# Altium project rp2350_led_control.PrjPcb (part 1 of 2)
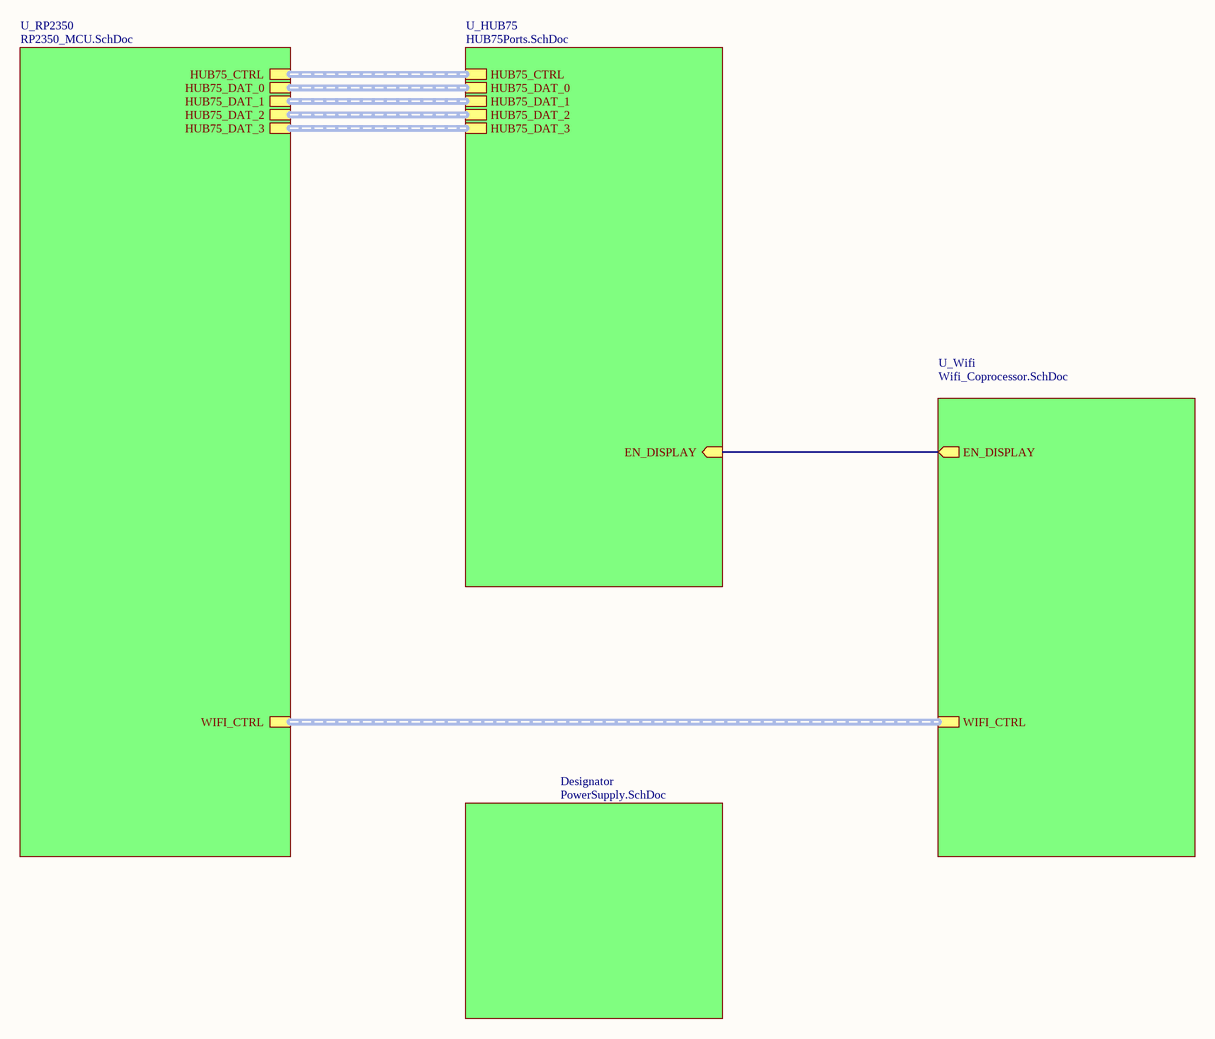
[diagram p0: Mainboard.SchDoc]
5 sheets, 168 parts. Net scope: hierarchical (ports join the sheet entries above them; power ports are global).
Board file: rp2350_led_control_pcb.PcbDoc
Sheets:
  Mainboard.SchDoc
    Designator = PowerSupply.SchDoc
    U_RP2350 = RP2350_MCU.SchDoc
    U_HUB75 = HUB75Ports.SchDoc
    U_Wifi = Wifi_Coprocessor.SchDoc

## Sheet Mainboard.SchDoc
size A3; SheetNumber: 1; SheetTotal: 5

### Sub-sheets
Designator = PowerSupply.SchDoc: no entries
U_HUB75 = HUB75Ports.SchDoc: HUB75_CTRL (harness HUB75_CTRL), HUB75_DAT_0 (harness HUB75_DAT_0), HUB75_DAT_1 (harness HUB75_DAT_1), HUB75_DAT_2 (harness HUB75_DAT_2), HUB75_DAT_3 (harness HUB75_DAT_3), EN_DISPLAY (in)
U_RP2350 = RP2350_MCU.SchDoc: HUB75_CTRL (harness HUB75_CTRL), WIFI_CTRL (harness WIFI_CTRL), HUB75_DAT_0 (harness HUB75_DAT_0), HUB75_DAT_2 (harness HUB75_DAT_2), HUB75_DAT_3 (harness HUB75_DAT_3), HUB75_DAT_1 (harness HUB75_DAT_1)
U_Wifi = Wifi_Coprocessor.SchDoc: WIFI_CTRL (harness WIFI_CTRL), EN_DISPLAY (out)

### Nets
EN_DISPLAY: sheet U_HUB75/EN_DISPLAY, sheet U_Wifi/EN_DISPLAY

### Buses and harness runs
harness sheet U_HUB75/HUB75_CTRL = sheet U_RP2350/HUB75_CTRL
harness sheet U_HUB75/HUB75_DAT_0 = sheet U_RP2350/HUB75_DAT_0
harness sheet U_HUB75/HUB75_DAT_1 = sheet U_RP2350/HUB75_DAT_1
harness sheet U_HUB75/HUB75_DAT_2 = sheet U_RP2350/HUB75_DAT_2
harness sheet U_HUB75/HUB75_DAT_3 = sheet U_RP2350/HUB75_DAT_3
harness sheet U_RP2350/WIFI_CTRL = sheet U_Wifi/WIFI_CTRL

## Sheet PowerSupply.SchDoc
size A3; SheetNumber: 2; SheetTotal: 5
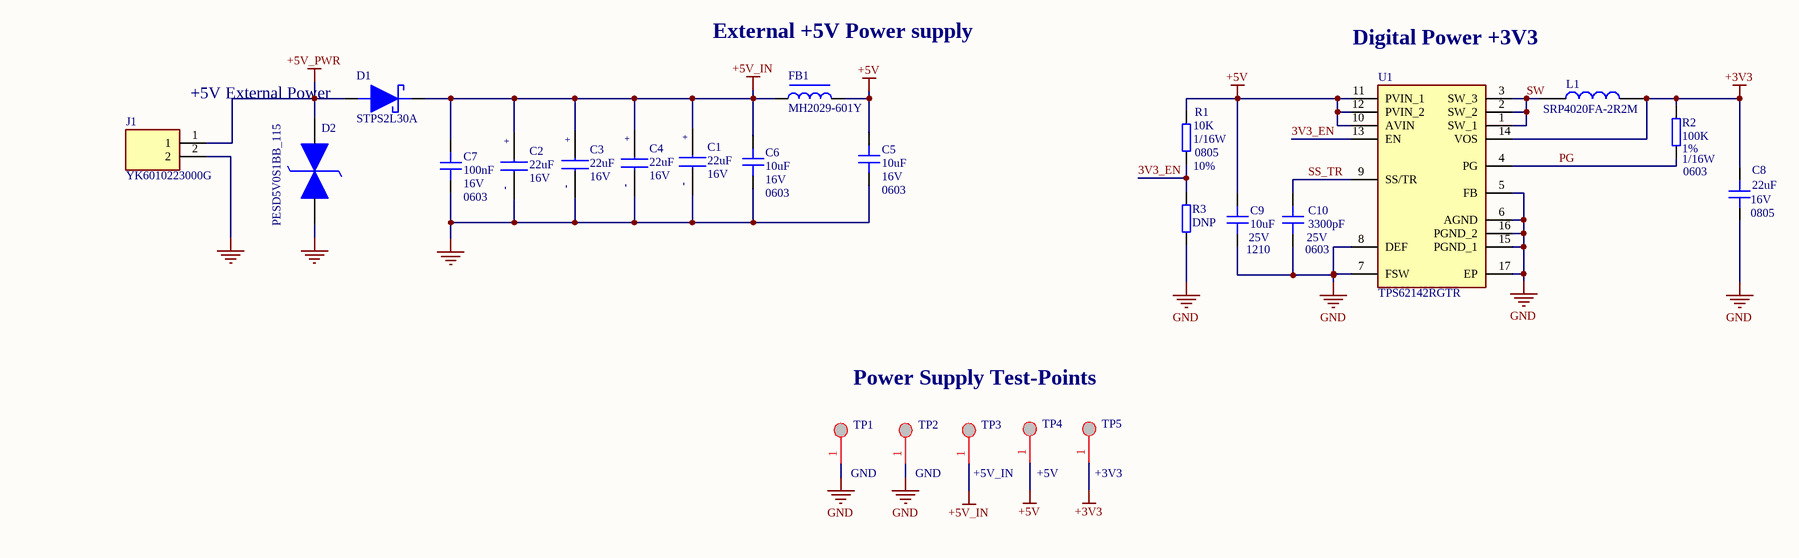
[diagram p1: PowerSupply.SchDoc]

### Parts
C1  value 22uF  Voltage: 16V  [CAPAE530X580N]  (hidden comment: 875105359003)
C2  value 22uF  Voltage: 16V  [CAPAE530X580N]  (hidden comment: 875105359003)
C3  value 22uF  Voltage: 16V  [CAPAE530X580N]  (hidden comment: 875105359003)
C4  value 22uF  Voltage: 16V  [CAPAE530X580N]  (hidden comment: 875105359003)
C5  10uF  Voltage: 16V  Package: 0603  [C0603]
C6  10uF  Voltage: 16V  Package: 0603  [C0603]
C7  100nF  Voltage: 16V  Package: 0603  [C0603]
C8  22uF  Voltage: 16V  Package: 0805  [C0805]
C9  10uF  Voltage: 25V  Package: 1210  [C1210]
C10  3300pF  Voltage: 25V  Package: 0603  [C0603]
D1  STPS2L30A  [SMA_STM]
D2  PESD5V0S1BB_115  [SODFL1608X65N]
FB1  MH2029-601Y  [BEADC2012X110N]
J1  YK6010223000G  [YK6010223000G]
L1  SRP4020FA-2R2M  [SRP4020FA2R2M]
R1  10K  Package: 0805  Tolerence: 10%  Power: 1/16W  [R0805_2012]
R2  100K  Package: 0603  Tolerence: 1%  Power: 1/16W  [R0603_1608]
R3  DNP  [R0805_2012]
TP1  GND  [Test point SDT8]
TP2  GND  [Test point SDT8]
TP3  +5V_IN  [Test point SDT8]
TP4  +5V  [Test point SDT8]
TP5  +3V3  [Test point SDT8]
U1  TPS62142RGTR  [QFN50P300X300X100-17N-D]

### Nets
+3V3: C8.2 L1.2 R2.2 TP5.1 U1.14(VOS)
+5V: C5.2 C9.2 FB1.2 R1.1 TP4.1 U1.10(AVIN) U1.11(PVIN_1) U1.12(PVIN_2)
+5V_IN: C1.1(+) C2.1(+) C3.1(+) C4.1(+) C6.2 C7.2 D1.1(K) FB1.1 TP3.1
+5V_PWR: D1.2(A) D2.2(K2) J1.1
GND: C1.2(-) C2.2(-) C3.2(-) C4.2(-) C5.1 C6.1 C7.1 C8.1 C9.1 C10.1 D2.1(K1) J1.2 R3.2 TP1.1 TP2.1 U1.5(FB) U1.6(AGND) U1.7(FSW) U1.8(DEF) U1.15(PGND_1) U1.16(PGND_2) U1.17(EP)
3V3_EN: R1.2 R3.1 U1.13(EN)
PG: R2.1 U1.4(PG)
SS_TR: C10.2 U1.9(SS/TR)
SW: L1.1 U1.1(SW_1) U1.2(SW_2) U1.3(SW_3)

### Notes on the sheet
- External +5V Power supply
- Digital Power +3V3
- (near J1) +5V External Power
- Power Supply Test-Points

### Library data of the parts
C1-C4 = 875105359003: WCAP-PSLP Aluminum Polymer Capacitors PSEC058220M016DVCTBB000; SMT V-Chip; 22 F +/- 20%; 16 V(DC); 2000 h; -55C / +105C; size DxL 5.0 x 5.8; ESR 30 m; Max. Iripple 2200 mA @100 kHz; LC 400 A; DF 8 %; Manufacturer_Name: Wurth Elektronik; Geometry.Height: 5.8mm; Manufacturer_Part_Number: 875105359003; Mouser Part Number: 710-875105359003; Mouser Price/Stock: https://www.mouser.co.uk/ProductDetail/Wurth-Elektronik/875105359003?qs=0KOYDY2FL29jQO14iscAeA%3D%3D; Arrow Part Number: *; Arrow Price/Stock: *; Datasheet Link: https://www.we-online.com/catalog/datasheet/875105359003.pdf
C5 C6 = CAP_0603_16V: SMD Capacitor; Tolerance: 10%; Temperature Coefficient: X7R; Designator: ?; Value: 10uF; Dielectric: ?; Manufacturer Reference: ?; Power: ?; Excepted: ?
C7 = CAP_0603_16V: SMD Capacitor; Designator: ?; Value: 100nF; Dielectric: ?; Manufacturer Reference: ?; Tolerance: ?; Power: ?; Excepted: ?
C8 = CAP_0805_16V: SMD Capacitor; Designator: ?; Value: 22uF; Dielectric: ?; Manufacturer Reference: ?; Tolerance: ?; Power: ?; Excepted: ?
C9 = CAP_1210_25V: SMD Capacitor; Designator: ?; Value: 10uF; Dielectric: ?; Manufacturer Reference: ?; Tolerance: ?; Power: ?; Excepted: ?
C10 = CAP_0603_25V: SMD Capacitor; Designator: ?; Value: 3300pF; Dielectric: ?; Manufacturer Reference: ?; Tolerance: ?; Power: ?; Excepted: ?
D1 = STPS2L30A: 30 V, 2 A Low Drop Power Schottky Rectifier; Manufacturer_Name: STMicroelectronics; Copyright: Copyright (C) 2025 Ultra Librarian. All rights reserved.; Manufacturer_Part_Number: STPS2L30A
D2 = PESD5V0S1BB_115: PESD5V0S1BB - Bidirectional ESD protection diode; Manufacturer_Name: Nexperia; Manufacturer_Part_Number: PESD5V0S1BB,115; Geometry.Height: 0.65mm; Mouser Part Number: 771-PESD5V0S1BB-T/R; Mouser Price/Stock: https://www.mouser.co.uk/ProductDetail/Nexperia/PESD5V0S1BB115?qs=LOCUfHb8d9vW06zz0pOppQ%3D%3D; Arrow Part Number: PESD5V0S1BB,115; Arrow Price/Stock: https://www.arrow.com/en/products/pesd5v0s1bb115/nexperia?region=nac; Datasheet Link: https://assets.nexperia.com/documents/data-sheet/PESD5V0S1BB.pdf
FB1 = MH2029-601Y: BOURNS - MH2029-601Y - FERRITE, BEAD, 0805, 0.2OHM, 1A; Geometry.Height: 1.1mm; Manufacturer_Name: Bourns; Manufacturer_Part_Number: MH2029-601Y; Mouser Part Number: 652-MH2029-601Y; Mouser Price/Stock: https://www.mouser.co.uk/ProductDetail/Bourns/MH2029-601Y?qs=aqFbwuCjQomuno9nfXC5VQ%3D%3D; Arrow Part Number: MH2029-601Y; Arrow Price/Stock: https://www.arrow.com/en/products/mh2029-601y/bourns?utm_currency=USD&region=europe; Datasheet Link: http://www.bourns.com/docs/Product-Datasheets/mh.pdf
J1 = YK6010223000G: 2 Circuit 0.394" (10.00mm) Barrier Block Connector Screws with Captive Plate 20A  300V PC Pin Through Hole -40C ~ 115C; Manufacturer_Name: Amphenol; Geometry.Height: 20mm; Manufacturer_Part_Number: YK6010223000G; Mouser Part Number: 649-YK60102230J0G; Mouser Price/Stock: https://www.mouser.co.uk/ProductDetail/Amphenol-Anytek/YK6010223000G?qs=Mv7BduZupUhsrUKvI0zJrA%3D%3D; Arrow Part Number: *; Arrow Price/Stock: *; Datasheet Link: https://www.anytek.com.tw/Upload/8YK0006601%E5%B7%B2%E8%9E%8D%E5%90%88-16535753519.pdf
L1 = SRP4020FA-2R2M: Fixed Inductors 2.2uH 20% 8A; Manufacturer_Name: Bourns; Geometry.Height: 2.1mm; Manufacturer_Part_Number: SRP4020FA-2R2M; Mouser Part Number: 652-SRP4020FA-2R2M; Mouser Price/Stock: https://www.mouser.co.uk/ProductDetail/Bourns/SRP4020FA-2R2M?qs=MLItCLRbWswKB3debRJXpA%3D%3D; Arrow Part Number: SRP4020FA-2R2M; Arrow Price/Stock: https://www.arrow.com/en/products/srp4020fa-2r2m/bourns.html?utm_currency=USD&region=nac; Datasheet Link: https://www.bourns.com/docs/Product-Datasheets/SRP4020FA.pdf
R1 R2 = Resistor: SMD Resistor; Voltage: ?; Dielectric: ?; Manufacturer Reference: ?; Excepted: ?
  R1: Designator: ?; Value: 10K
  R2: Value: 100K
R3 = Resistor: SMD Resistor; Tolerence: 1%; Power: 1/16W; Designator: ?; Value: DNP; Voltage: ?; Dielectric: ?; Manufacturer Reference: ?; Package: 0805; Excepted: ?
TP1-TP5 = TEST_P SDT8: Designator: ?; Dielectric: ?; Excepted: ?; Package: ?; Power: ?; Tolerance: ?; Value: ?; Voltage: ?
U1 = TPS62142RGTR: TEXAS INSTRUMENTS - TPS62142RGTR - DC/DC CONV, SYNC BUCK, 2.5MHZ, VQFN-16, Switch step down converter; Geometry.Height: 1mm; Manufacturer_Name: Texas Instruments; Manufacturer_Part_Number: TPS62142RGTR; Mouser Part Number: 595-TPS62142RGTR; Mouser Price/Stock: https://www.mouser.co.uk/ProductDetail/Texas-Instruments/TPS62142RGTR?qs=gXEV9p%2FxLgdJ2ViLpYqiRw%3D%3D; Arrow Part Number: TPS62142RGTR; Arrow Price/Stock: https://www.arrow.com/en/products/tps62142rgtr/texas-instruments?region=nac; Datasheet Link: http://www.ti.com/lit/ds/symlink/tps62140.pdf

## Sheet RP2350_MCU.SchDoc
size A3; SheetNumber: 3; SheetTotal: 5
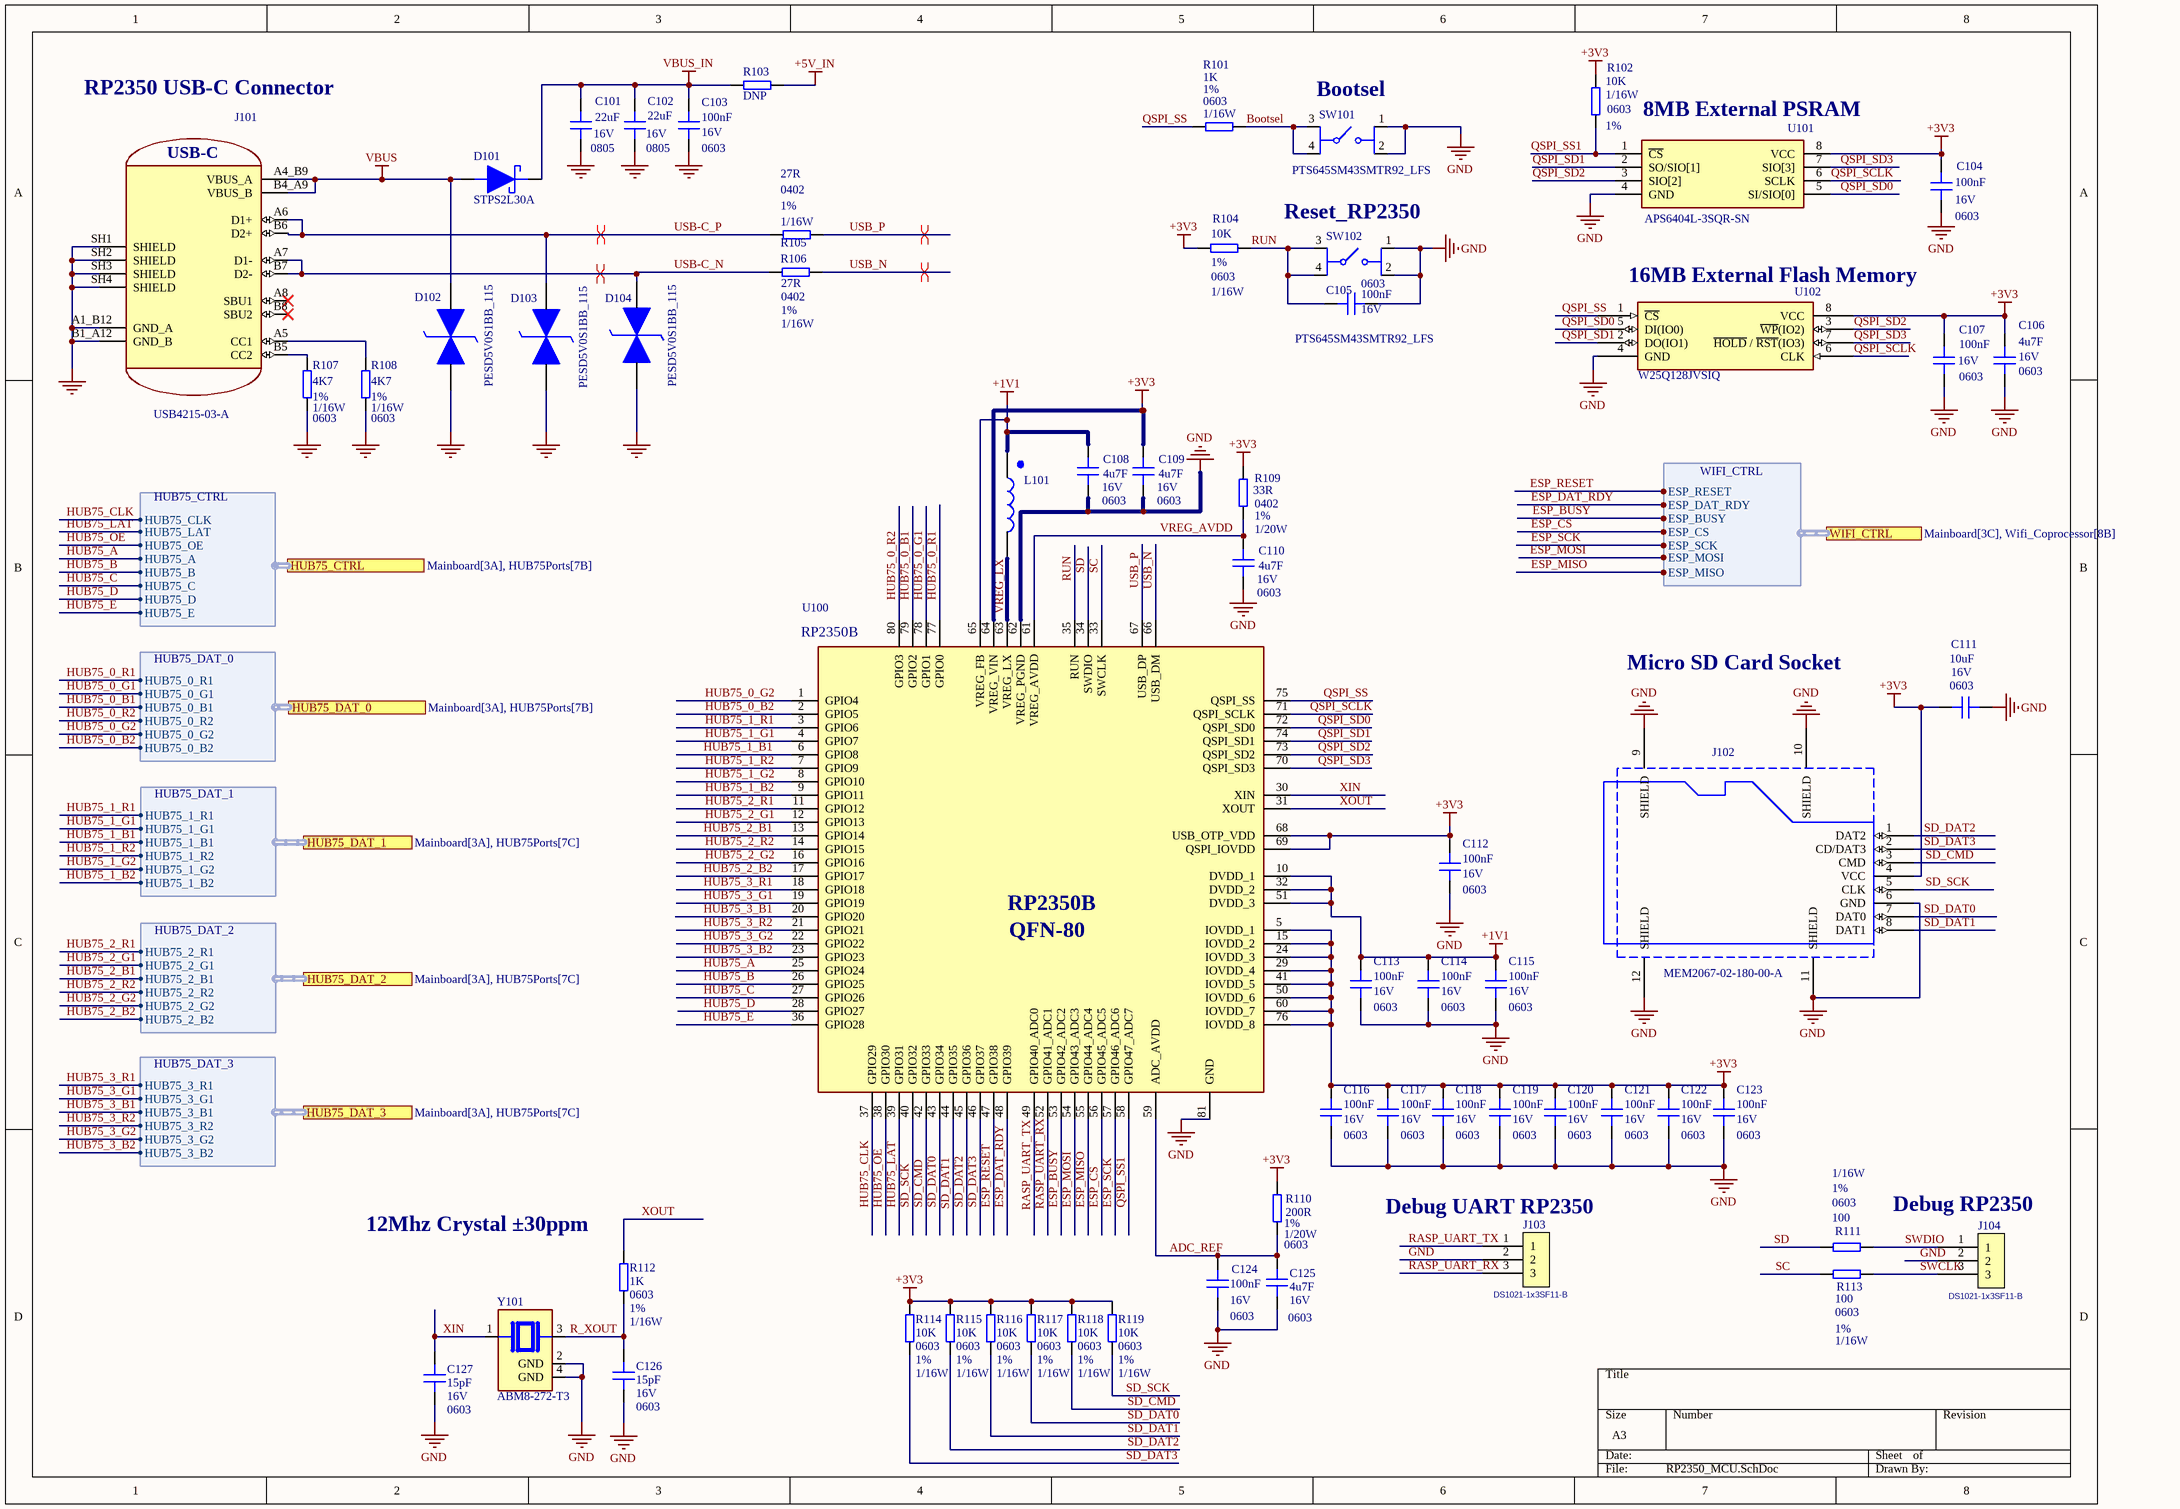
[diagram p2: RP2350_MCU.SchDoc]

### Parts
C101  22uF  Voltage: 16V  Package: 0805  [C0805]
C102  22uF  Voltage: 16V  Package: 0805  [C0805]
C103  100nF  Voltage: 16V  Package: 0603  [C0603]
C104  100nF  Voltage: 16V  Package: 0603  [C0603]
C105  100nF  Voltage: 16V  Package: 0603  [C0603]
C106  4u7F  Voltage: 16V  Package: 0603  [C0603]
C107  100nF  Voltage: 16V  Package: 0603  [C0603]
C108  4u7F  Voltage: 16V  Package: 0603  [C0603]
C109  4u7F  Voltage: 16V  Package: 0603  [C0603]
C110  4u7F  Voltage: 16V  Package: 0603  [C0603]
C111  10uF  Voltage: 16V  Package: 0603  [C0603]
C112  100nF  Voltage: 16V  Package: 0603  [C0402]
C113  100nF  Voltage: 16V  Package: 0603  [C0603]
C114  100nF  Voltage: 16V  Package: 0603  [C0603]
C115  100nF  Voltage: 16V  Package: 0603  [C0603]
C116  100nF  Voltage: 16V  Package: 0603  [C0603]
C117  100nF  Voltage: 16V  Package: 0603  [C0603]
C118  100nF  Voltage: 16V  Package: 0603  [C0603]
C119  100nF  Voltage: 16V  Package: 0603  [C0603]
C120  100nF  Voltage: 16V  Package: 0603  [C0603]
C121  100nF  Voltage: 16V  Package: 0603  [C0603]
C122  100nF  Voltage: 16V  Package: 0603  [C0603]
C123  100nF  Voltage: 16V  Package: 0603  [C0603]
C124  100nF  Voltage: 16V  Package: 0603  [C0603]
C125  4u7F  Voltage: 16V  Package: 0603  [C0603]
C126  15pF  Voltage: 16V  Package: 0603  [C0603]
C127  15pF  Voltage: 16V  Package: 0603  [C0603]
D101  STPS2L30A  [SMA_STM]
D102  PESD5V0S1BB_115  [SODFL1608X65N]
D103  PESD5V0S1BB_115  [SODFL1608X65N]
D104  PESD5V0S1BB_115  [SODFL1608X65N]
J101  USB4215-03-A  [GCT_USB4215-03-A_REVA]
J102  MEM2067-02-180-00-A  [GCT_MEM2067-02-180-00-A_REVB]
J103  DS1021-1x3SF11-B  [HDR-TH_3P-P2.54-V-M]
J104  DS1021-1x3SF11-B  [HDR-TH_3P-P2.54-V-M]
L101  AOTA-B201610S3R3-101-T  [AOTAB201610S3R3101T]  (value not drawn)
R101  1K  Package: 0603  Tolerence: 1%  Power: 1/16W  [R0603_1608]
R102  10K  Package: 0603  Tolerence: 1%  Power: 1/16W  [R0603_1608]
R103  DNP  [R0805_2012]
R104  10K  Package: 0603  Tolerence: 1%  Power: 1/16W  [R0603_1608]
R105  27R  Package: 0402  Tolerence: 1%  Power: 1/16W  [R0402_1005]
R106  27R  Package: 0402  Tolerence: 1%  Power: 1/16W  [R0402_1005]
R107  4K7  Package: 0603  Tolerence: 1%  Power: 1/16W  [R0603_1608]
R108  4K7  Package: 0603  Tolerence: 1%  Power: 1/16W  [R0603_1608]
R109  33R  Package: 0402  Tolerence: 1%  Power: 1/20W  [R0402_1005]
R110  200R  Package: 0603  Tolerence: 1%  Power: 1/20W  [R0603_1608]
R111  100  Package: 0603  Tolerence: 1%  Power: 1/16W  [R0603_1608]
R112  1K  Package: 0603  Tolerence: 1%  Power: 1/16W  [R0603_1608]
R113  100  Package: 0603  Tolerence: 1%  Power: 1/16W  [R0603_1608]
R114  10K  Package: 0603  Tolerence: 1%  Power: 1/16W  [R0603_1608]
R115  10K  Package: 0603  Tolerence: 1%  Power: 1/16W  [R0603_1608]
R116  10K  Package: 0603  Tolerence: 1%  Power: 1/16W  [R0603_1608]
R117  10K  Package: 0603  Tolerence: 1%  Power: 1/16W  [R0603_1608]
R118  10K  Package: 0603  Tolerence: 1%  Power: 1/16W  [R0603_1608]
R119  10K  Package: 0603  Tolerence: 1%  Power: 1/16W  [R0603_1608]
SW101  PTS645SM43SMTR92_LFS  [PTS645SM43SMTR92LFS]
SW102  PTS645SM43SMTR92_LFS  [PTS645SM43SMTR92LFS]
U100  RP2350B  [QFN40P1000X1000X90-81N-D]
U101  APS6404L-3SQR-SN  [SOIC127P600X175-8N]
U102  W25Q128JVSIQ  [SOIC127P790X216-8N]
Y101  ABM8-272-T3  [XTAL_ABM8-272-T3]

### Ports
HUB75_CTRL (harness HUB75_CTRL, see Mainboard[3A], HUB75Ports[7B]), HUB75_DAT_0 (harness HUB75_DAT_0, see Mainboard[3A], HUB75Ports[7B]), HUB75_DAT_1 (harness HUB75_DAT_1, see Mainboard[3A], HUB75Ports[7C]), HUB75_DAT_2 (harness HUB75_DAT_2, see Mainboard[3A], HUB75Ports[7C]), HUB75_DAT_3 (harness HUB75_DAT_3, see Mainboard[3A], HUB75Ports[7C]), WIFI_CTRL (harness WIFI_CTRL, see Mainboard[3C], Wifi_Coprocessor[8B])

### Harnesses
WIFI_CTRL: ESP_RESET, ESP_DAT_RDY, ESP_BUSY, ESP_CS, ESP_SCK, ESP_MOSI, ESP_MISO
HUB75_CTRL: HUB75_CLK, HUB75_LAT, HUB75_OE, HUB75_A, HUB75_B, HUB75_C, HUB75_D, HUB75_E
HUB75_DAT_0: HUB75_0_R1, HUB75_0_G1, HUB75_0_B1, HUB75_0_R2, HUB75_0_G2, HUB75_0_B2
HUB75_DAT_1: HUB75_1_R1, HUB75_1_G1, HUB75_1_B1, HUB75_1_R2, HUB75_1_G2, HUB75_1_B2
HUB75_DAT_2: HUB75_2_R1, HUB75_2_G1, HUB75_2_B1, HUB75_2_R2, HUB75_2_G2, HUB75_2_B2
HUB75_DAT_3: HUB75_3_R1, HUB75_3_G1, HUB75_3_B1, HUB75_3_R2, HUB75_3_G2, HUB75_3_B2

### Nets
+1V1: C108.2 C113.2 C114.2 C115.2 L101.1 U100.10(DVDD_1) U100.32(DVDD_2) U100.51(DVDD_3) U100.65(VREG_FB)
+3V3: C104.2 C106.2 C107.2 C109.2 C111.2 C112.2 C116.2 C117.2 C118.2 C119.2 C120.2 C121.2 C122.2 C123.2 J102.4(VCC) R102.2 R104.1 R109.2 R110.2 R114.1 R115.1 R116.1 R117.1 R118.1 R119.1 U100.5(IOVDD_1) U100.15(IOVDD_2) U100.24(IOVDD_3) U100.29(IOVDD_4) U100.41(IOVDD_5) U100.50(IOVDD_6) U100.60(IOVDD_7) U100.64(VREG_VIN) U100.68(USB_OTP_VDD) U100.69(QSPI_IOVDD) U100.76(IOVDD_8) U101.8(VCC) U102.8(VCC)
+5V_IN: R103.2
GND: C101.1 C102.1 C103.1 C104.1 C105.1 C106.1 C107.1 C108.1 C109.1 C110.1 C111.1 C112.1 C113.1 C114.1 C115.1 C116.1 C117.1 C118.1 C119.1 C120.1 C121.1 C122.1 C123.1 C124.1 C125.1 C126.1 C127.1 D102.1(K1) D103.1(K1) D104.1(K1) J101.A1_B12(GND_A) J101.B1_A12(GND_B) J101.SH1(SHIELD) J101.SH2(SHIELD) J101.SH3(SHIELD) J101.SH4(SHIELD) J102.6(GND) J102.9(SHIELD) J102.10(SHIELD) J102.11(SHIELD) J102.12(SHIELD) J103.2 J104.2 R107.1 R108.1 SW101.1(NO_1) SW101.2(NO_2) SW102.1(NO_1) SW102.2(NO_2) U100.62(VREG_PGND) U100.81(GND) U101.4(GND) U102.4(GND) Y101.2(GND) Y101.4(GND)
VBUS: D101.2(A) D102.2(K2) J101.A4_B9(VBUS_A) J101.B4_A9(VBUS_B)
VBUS_IN: C101.2 C102.2 C103.2 D101.1(K) R103.1
ADC_REF: C124.2 C125.2 R110.1 U100.59(ADC_AVDD)
Bootsel: R101.2 SW101.3(COM_1) SW101.4(COM_2)
ESP_BUSY: U100.53(GPIO42_ADC2) ; port WIFI_CTRL.ESP_BUSY
ESP_CS: U100.56(GPIO45_ADC5) ; port WIFI_CTRL.ESP_CS
ESP_DAT_RDY: U100.48(GPIO39) ; port WIFI_CTRL.ESP_DAT_RDY
ESP_MISO: U100.55(GPIO44_ADC4) ; port WIFI_CTRL.ESP_MISO
ESP_MOSI: U100.54(GPIO43_ADC3) ; port WIFI_CTRL.ESP_MOSI
ESP_RESET: U100.47(GPIO38) ; port WIFI_CTRL.ESP_RESET
ESP_SCK: U100.57(GPIO46_ADC6) ; port WIFI_CTRL.ESP_SCK
HUB75_0_B1: U100.79(GPIO2) ; port HUB75_DAT_0.HUB75_0_B1
HUB75_0_B2: U100.2(GPIO5) ; port HUB75_DAT_0.HUB75_0_B2
HUB75_0_G1: U100.78(GPIO1) ; port HUB75_DAT_0.HUB75_0_G1
HUB75_0_G2: U100.1(GPIO4) ; port HUB75_DAT_0.HUB75_0_G2
HUB75_0_R1: U100.77(GPIO0) ; port HUB75_DAT_0.HUB75_0_R1
HUB75_0_R2: U100.80(GPIO3) ; port HUB75_DAT_0.HUB75_0_R2
HUB75_1_B1: U100.6(GPIO8) ; port HUB75_DAT_1.HUB75_1_B1
HUB75_1_B2: U100.9(GPIO11) ; port HUB75_DAT_1.HUB75_1_B2
HUB75_1_G1: U100.4(GPIO7) ; port HUB75_DAT_1.HUB75_1_G1
HUB75_1_G2: U100.8(GPIO10) ; port HUB75_DAT_1.HUB75_1_G2
HUB75_1_R1: U100.3(GPIO6) ; port HUB75_DAT_1.HUB75_1_R1
HUB75_1_R2: U100.7(GPIO9) ; port HUB75_DAT_1.HUB75_1_R2
HUB75_2_B1: U100.13(GPIO14) ; port HUB75_DAT_2.HUB75_2_B1
HUB75_2_B2: U100.17(GPIO17) ; port HUB75_DAT_2.HUB75_2_B2
HUB75_2_G1: U100.12(GPIO13) ; port HUB75_DAT_2.HUB75_2_G1
HUB75_2_G2: U100.16(GPIO16) ; port HUB75_DAT_2.HUB75_2_G2
HUB75_2_R1: U100.11(GPIO12) ; port HUB75_DAT_2.HUB75_2_R1
HUB75_2_R2: U100.14(GPIO15) ; port HUB75_DAT_2.HUB75_2_R2
HUB75_3_B1: U100.20(GPIO20) ; port HUB75_DAT_3.HUB75_3_B1
HUB75_3_B2: U100.23(GPIO23) ; port HUB75_DAT_3.HUB75_3_B2
HUB75_3_G1: U100.19(GPIO19) ; port HUB75_DAT_3.HUB75_3_G1
HUB75_3_G2: U100.22(GPIO22) ; port HUB75_DAT_3.HUB75_3_G2
HUB75_3_R1: U100.18(GPIO18) ; port HUB75_DAT_3.HUB75_3_R1
HUB75_3_R2: U100.21(GPIO21) ; port HUB75_DAT_3.HUB75_3_R2
HUB75_A: U100.25(GPIO24) ; port HUB75_CTRL.HUB75_A
HUB75_B: U100.26(GPIO25) ; port HUB75_CTRL.HUB75_B
HUB75_C: U100.27(GPIO26) ; port HUB75_CTRL.HUB75_C
HUB75_CLK: U100.37(GPIO29) ; port HUB75_CTRL.HUB75_CLK
HUB75_D: U100.28(GPIO27) ; port HUB75_CTRL.HUB75_D
HUB75_E: U100.36(GPIO28) ; port HUB75_CTRL.HUB75_E
HUB75_LAT: U100.39(GPIO31) ; port HUB75_CTRL.HUB75_LAT
HUB75_OE: U100.38(GPIO30) ; port HUB75_CTRL.HUB75_OE
QSPI_SCLK: U100.71(QSPI_SCLK) U101.6(SCLK) U102.6(CLK)
QSPI_SD0: U100.72(QSPI_SD0) U101.5(SI/SIO[0]) U102.5(DI(IO0))
QSPI_SD1: U100.74(QSPI_SD1) U101.2(SO/SIO[1]) U102.2(DO(IO1))
QSPI_SD2: U100.73(QSPI_SD2) U101.3(SIO[2]) U102.3(~{WP}(IO2))
QSPI_SD3: U100.70(QSPI_SD3) U101.7(SIO[3]) U102.7(~{HOLD}_/_~{RST}(IO3))
QSPI_SS: R101.1 U100.75(QSPI_SS) U102.1(~{CS})
QSPI_SS1: R102.1 U100.58(GPIO47_ADC7) U101.1(~{CS})
R_XOUT: C126.2 R112.2 Y101.3
RASP_UART_RX: J103.3 U100.52(GPIO41_ADC1)
RASP_UART_TX: J103.1 U100.49(GPIO40_ADC0)
RUN: C105.2 R104.2 SW102.3(COM_1) SW102.4(COM_2) U100.35(RUN)
SC: R113.1 U100.33(SWCLK)
SD: R111.1 U100.34(SWDIO)
SD_CMD: J102.3(CMD) R118.2 U100.42(GPIO33)
SD_DAT0: J102.7(DAT0) R117.2 U100.43(GPIO34)
SD_DAT1: J102.8(DAT1) R116.2 U100.44(GPIO35)
SD_DAT2: J102.1(DAT2) R115.2 U100.45(GPIO36)
SD_DAT3: J102.2(CD/DAT3) R114.2 U100.46(GPIO37)
SD_SCK: J102.5(CLK) R119.2 U100.40(GPIO32)
SWCLK: J104.3 R113.2
SWDIO: J104.1 R111.2
USB-C_N: D104.2(K2) J101.A7(D1-) J101.B7(D2-) R106.1
USB-C_P: D103.2(K2) J101.A6(D1+) J101.B6(D2+) R105.1
USB_N: R106.2 U100.66(USB_DM)
USB_P: R105.2 U100.67(USB_DP)
VREG_AVDD: C110.2 R109.1 U100.61(VREG_AVDD)
VREG_LX: L101.2 U100.63(VREG_LX)
XIN: C127.2 U100.30(XIN) Y101.1
XOUT: R112.1 U100.31(XOUT)
NetJ101_A5: J101.A5(CC1) R108.2
NetJ101_B5: J101.B5(CC2) R107.2

Not connected (* = marked no-connect by the designer): J101 A8(SBU1)* B8(SBU2)*

### Layout directives
differential pair; differential pair class DIFF_USB: USB-C_N, USB-C_P, USB_N, USB_P

### Notes on the sheet
- RP2350 USB-C Connector
- (near SW101) Bootsel
- 8MB External PSRAM
- (near SW102) Reset_RP2350
- (near U102) 16MB External Flash Memory
- Micro SD Card Socket
- (near R112) 12Mhz Crystal ±30ppm
- (near J103) Debug UART RP2350
- Debug RP2350
- (in symbol RP2350B) QFN-80
- (in symbol USB4215-03-A) USB-C

### Library data of the parts
C101 C102 = CAP_0805_16V: SMD Capacitor; Designator: ?; Value: 22uF; Dielectric: ?; Manufacturer Reference: ?; Tolerance: ?; Power: ?; Excepted: ?
C103-C105 C107 C113-C124 C126 C127 = CAP_0603_16V: SMD Capacitor; Dielectric: ?; Manufacturer Reference: ?; Tolerance: ?; Power: ?; Excepted: ?
  C103-C105 C107: Designator: ?; Value: 100nF
  C113-C124: Value: 100nF
  C126 C127: Value: 15pF
C106 C108-C111 C125 = CAP_0603_16V: as C5 on sheet PowerSupply; Designator: ?; Dielectric: ?; Manufacturer Reference: ?; Power: ?; Excepted: ?
  C106 C108-C110 C125: Value: 4u7F
  C111: Value: 10uF
C112 = CAP_0402_16V: SMD Capacitor; Value: 100nF; Dielectric: ?; Manufacturer Reference: ?; Tolerance: ?; Power: ?; Excepted: ?
D101 = STPS2L30A: as D1 on sheet PowerSupply; Copyright: Copyright (C) 2025 Ultra Librarian. All rights reserved.; Manufacturer_Part_Number: STPS2L30A
D102-D104 = PESD5V0S1BB_115: as D2 on sheet PowerSupply; Mouser Part Number: 771-PESD5V0S1BB-T/R; Mouser Price/Stock: https://www.mouser.co.uk/ProductDetail/Nexperia/PESD5V0S1BB115?qs=LOCUfHb8d9vW06zz0pOppQ%3D%3D; Arrow Part Number: PESD5V0S1BB,115; Arrow Price/Stock: https://www.arrow.com/en/products/pesd5v0s1bb115/nexperia?region=nac; Datasheet Link: https://assets.nexperia.com/documents/data-sheet/PESD5V0S1BB.pdf
J101 = USB4215-03-A: USB-C (USB TYPE-C) USB 2.0 Receptacle Connector 24 (16+8 Dummy) Position Surface Mount, Right Angle; Through Hole; MF: Global Connector Technology; SnapEDA_Link: https://www.snapeda.com/parts/USB4215-03-A/Global+Connector+Technology/view-part/?ref=snap; Package: None; Value: *; MP: USB4215-03-A; Check_prices: https://www.snapeda.com/parts/USB4215-03-A/Global+Connector+Technology/view-part/?ref=eda
J102 = MEM2067-02-180-00-A: Micro SD Memory Card ConnectorSMT, Hinged, 1.80mm Profile; MP: MEM2067-02-180-00-A_REVB; Price: None; Value: *; Package: None; Availability: Unavailable
J103 J104 = DS1021-1x3SF11-B: Manufacturer: CONNFLY; Add into BOM: yes; Pin Structure: 1x3P; Pitch: 2.54mm; Circluar Pins/Square Pins: Pin Header; Current Rating: 3A; Voltage Rating (Max): 250V; Symbol: DS1021-1X3SF11-B; Device: DS1021-1x3SF11-B; LCSC Part Name: 1x3P 间距:2.54mm 方针 直插; Supplier Part: C7430359; Manufacturer Part: DS1021-1x3SF11-B; Supplier Footprint: 插件,P=2.54mm; JLCPCB Part Class: Extended Part; Datasheet: https://item.szlcsc.com/datasheet/DS1021-1x3SF11-B/8430012.html; Supplier: LCSC; Convert to PCB: yes; Mounting Type: Through Hole; Number of Rows: 1; Number of Pins: 3P; Contact Material: Copper Alloy; Contact Plating: Gold; Operating Temperature: -40℃~+105℃; Color: Black; Designator: ?; Dielectric: ?; Excepted: ?; Package: ?; Power: ?; Tolerance: ?; Value: ?; Voltage: ?
L101 = AOTA-B201610S3R3-101-T: 3.3 µH Shielded Molded Inductor 2.1 A 140mOhm Max 0806 (2016 Metric); Manufacturer_Name: ABRACON; Geometry.Height: 1mm; Manufacturer_Part_Number: AOTA-B201610S3R3-101-T; Mouser Part Number: 815-AB201610S3R3101T; Mouser Price/Stock: https://www.mouser.co.uk/ProductDetail/ABRACON/AOTA-B201610S3R3-101-T?qs=%252BXxaIXUDbq0IZvJW%2F2mv4w%3D%3D; Arrow Part Number: AOTA-B201610S3R3-101-T; Arrow Price/Stock: https://www.arrow.com/en/products/aota-b201610s3r3-101-t/abracon.html?utm_currency=USD&region=nac; Datasheet Link: https://abracon.com/datasheets/AOTA-B201610S3R3-101-T.pdf
R101 R102 R104-R119 = Resistor: SMD Resistor; Designator: ?; Dielectric: ?; Manufacturer Reference: ?; Excepted: ?
  R101 R112: Value: 1K; Voltage: ?
  R102 R104 R114-R119: Value: 10K; Voltage: ?
  R105 R106: Value: 27R
  R107 R108: Value: 4K7; Voltage: ?
  R109: Value: 33R; Voltage: ?
  R110: Value: 200R; Voltage: ?
  R111 R113: Value: 100; Voltage: ?
R103 = Resistor: as R3 on sheet PowerSupply; Designator: ?; Value: DNP; Voltage: ?; Dielectric: ?; Manufacturer Reference: ?; Package: 0805; Excepted: ?
SW101 SW102 = PTS645SM43SMTR92_LFS: Tactile Switch, PTS645 Series, Top Actuated, Surface Mount, Round Button, 160 gf, 50mA at 12VDC; Manufacturer_Name: LITTELFUSE; Manufacturer_Part_Number: PTS645SM43SMTR92 LFS; Datasheet Link: https://www.ckswitches.com/media/1471/pts645.pdf; Height: 4.4mm; Mouser Part Number: 611-PTS645SM43SMTR92; Mouser Price/Stock: https://www.mouser.co.uk/ProductDetail/CK/PTS645SM43SMTR92-LFS?qs=Imq1NPwxi75hrUk5xRQGSg%3D%3D; Arrow Part Number: PTS645SM43SMTR92 LFS; Arrow Price/Stock: https://www.arrow.com/en/products/pts645sm43smtr92lfs/ck?utm_currency=USD&region=nac
U100 = RP2350B: Dual Arm Cortex-M33 or dual Hazard3 RISC-V processors @ 150MHz; Manufacturer_Name: RASPBERRY-PI; Geometry.Height: 0.9mm; Manufacturer_Part_Number: RP2350B; Mouser Part Number: *; Mouser Price/Stock: *; Arrow Part Number: *; Arrow Price/Stock: *; Datasheet Link: https://datasheets.raspberrypi.com/rp2350/rp2350-product-brief.pdf
U101 = APS6404L-3SQR-SN: DRAM IoT RAM 64Mb QSPI (x1,x4) SDR 133/84MHz, RBX, 3V, Ind. Temp., SOP8; Manufacturer_Name: AP Memory; Geometry.Height: 1.75mm; Manufacturer_Part_Number: APS6404L-3SQR-SN; Mouser Part Number: 878-APS6404L-3SQR-SN; Mouser Price/Stock: https://www.mouser.co.uk/ProductDetail/AP-Memory/APS6404L-3SQR-SN?qs=IS%252B4QmGtzzqsn3S5xo%2FEEg%3D%3D; Arrow Part Number: *; Arrow Price/Stock: *; Datasheet Link: https://eu.mouser.com/datasheet/2/1127/APM_PSRAM_QSPI_APS6404L_3SQR_v2_3_PKG-1954826.pdf
U102 = W25Q128JVSIQ: FLASH - NOR Memory IC 128Mb (16M x 8) SPI - Quad I/O, QPI, DTR 133 MHz 8-SOIC; MF: Winbond Electronics; SnapEDA_Link: https://www.snapeda.com/parts/W25Q128JVSIQ/Winbond/view-part/?ref=snap; Package: SOIC-8 Winbond Electronics; Value: *; MP: W25Q128JVSIQ; Check_prices: https://www.snapeda.com/parts/W25Q128JVSIQ/Winbond/view-part/?ref=eda
Y101 = ABM8-272-T3: 12 MHz Â±30ppm Crystal 10pF 50 Ohms 4-SMD, No Lead; MF: ABRACON; SnapEDA_Link: https://www.snapeda.com/parts/ABM8-272-T3/Abracon/view-part/?ref=snap; Package: NON-STANDARD-4 Abracon; Value: *; MP: ABM8-272-T3; Check_prices: https://www.snapeda.com/parts/ABM8-272-T3/Abracon/view-part/?ref=eda

## Sheet HUB75Ports.SchDoc
size A3; SheetNumber: 5; SheetTotal: 5
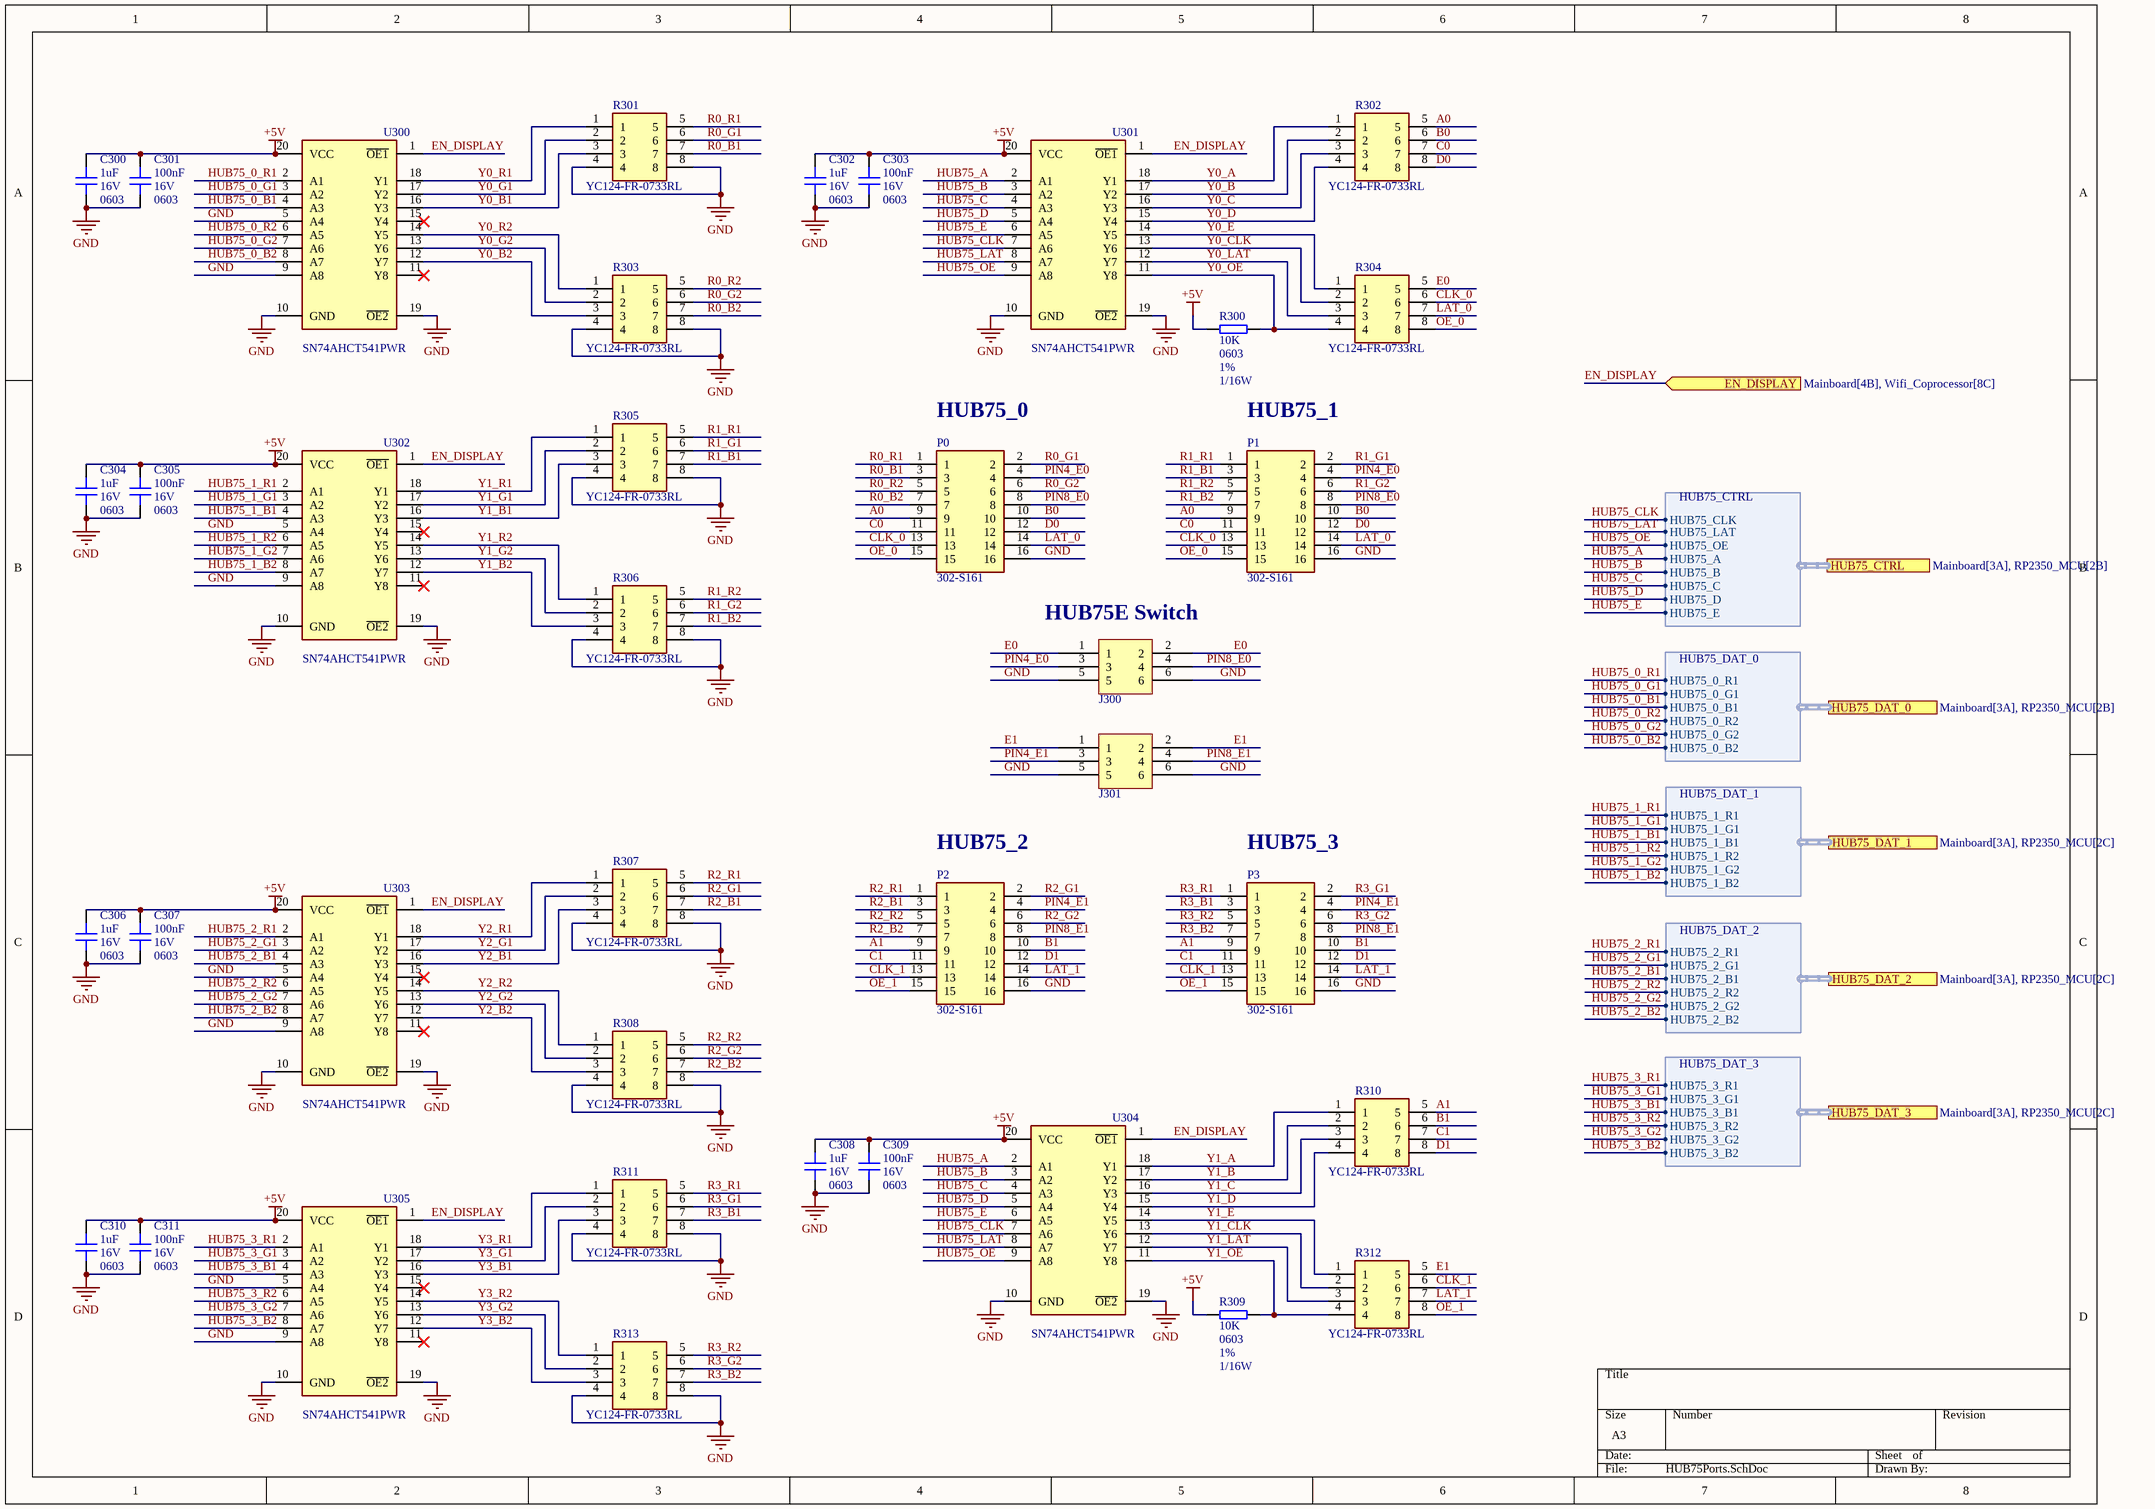
[diagram p3: HUB75Ports.SchDoc]

### Parts
C300  1uF  Voltage: 16V  Package: 0603  [C0603]
C301  100nF  Voltage: 16V  Package: 0603  [C0603]
C302  1uF  Voltage: 16V  Package: 0603  [C0603]
C303  100nF  Voltage: 16V  Package: 0603  [C0603]
C304  1uF  Voltage: 16V  Package: 0603  [C0603]
C305  100nF  Voltage: 16V  Package: 0603  [C0603]
C306  1uF  Voltage: 16V  Package: 0603  [C0603]
C307  100nF  Voltage: 16V  Package: 0603  [C0603]
C308  1uF  Voltage: 16V  Package: 0603  [C0603]
C309  100nF  Voltage: 16V  Package: 0603  [C0603]
C310  1uF  Voltage: 16V  Package: 0603  [C0603]
C311  100nF  Voltage: 16V  Package: 0603  [C0603]
J300  ZX-PZ2.54-2-3PZZ  [HDR-TH_6P-P2.54-V-M-R2-C3-S2.54-1]  (value not drawn)
J301  ZX-PZ2.54-2-3PZZ  [HDR-TH_6P-P2.54-V-M-R2-C3-S2.54-1]  (value not drawn)
P0  302-S161  [SHDR16W66P254_2X8_2792X905X905P]
P1  302-S161  [SHDR16W66P254_2X8_2792X905X905P]
P2  302-S161  [SHDR16W66P254_2X8_2792X905X905P]
P3  302-S161  [SHDR16W66P254_2X8_2792X905X905P]
R300  10K  Package: 0603  Tolerence: 1%  Power: 1/16W  [R0603_1608]
R301  YC124-FR-0733RL  [YC124FR0733RL]
R302  YC124-FR-0733RL  [YC124FR0733RL]
R303  YC124-FR-0733RL  [YC124FR0733RL]
R304  YC124-FR-0733RL  [YC124FR0733RL]
R305  YC124-FR-0733RL  [YC124FR0733RL]
R306  YC124-FR-0733RL  [YC124FR0733RL]
R307  YC124-FR-0733RL  [YC124FR0733RL]
R308  YC124-FR-0733RL  [YC124FR0733RL]
R309  10K  Package: 0603  Tolerence: 1%  Power: 1/16W  [R0603_1608]
R310  YC124-FR-0733RL  [YC124FR0733RL]
R311  YC124-FR-0733RL  [YC124FR0733RL]
R312  YC124-FR-0733RL  [YC124FR0733RL]
R313  YC124-FR-0733RL  [YC124FR0733RL]
U300  SN74AHCT541PWR  [SOP65P640X120-20N]
U301  SN74AHCT541PWR  [SOP65P640X120-20N]
U302  SN74AHCT541PWR  [SOP65P640X120-20N]
U303  SN74AHCT541PWR  [SOP65P640X120-20N]
U304  SN74AHCT541PWR  [SOP65P640X120-20N]
U305  SN74AHCT541PWR  [SOP65P640X120-20N]

### Ports
EN_DISPLAY (in, see Mainboard[4B], Wifi_Coprocessor[8C]), HUB75_CTRL (harness HUB75_CTRL, see Mainboard[3A], RP2350_MCU[2B]), HUB75_DAT_0 (harness HUB75_DAT_0, see Mainboard[3A], RP2350_MCU[2B]), HUB75_DAT_1 (harness HUB75_DAT_1, see Mainboard[3A], RP2350_MCU[2C]), HUB75_DAT_2 (harness HUB75_DAT_2, see Mainboard[3A], RP2350_MCU[2C]), HUB75_DAT_3 (harness HUB75_DAT_3, see Mainboard[3A], RP2350_MCU[2C])

### Harnesses
HUB75_CTRL: HUB75_CLK, HUB75_LAT, HUB75_OE, HUB75_A, HUB75_B, HUB75_C, HUB75_D, HUB75_E
HUB75_DAT_0: HUB75_0_R1, HUB75_0_G1, HUB75_0_B1, HUB75_0_R2, HUB75_0_G2, HUB75_0_B2
HUB75_DAT_1: HUB75_1_R1, HUB75_1_G1, HUB75_1_B1, HUB75_1_R2, HUB75_1_G2, HUB75_1_B2
HUB75_DAT_2: HUB75_2_R1, HUB75_2_G1, HUB75_2_B1, HUB75_2_R2, HUB75_2_G2, HUB75_2_B2
HUB75_DAT_3: HUB75_3_R1, HUB75_3_G1, HUB75_3_B1, HUB75_3_R2, HUB75_3_G2, HUB75_3_B2

### Nets
+5V: C300.2 C301.2 C302.2 C303.2 C304.2 C305.2 C306.2 C307.2 C308.2 C309.2 C310.2 C311.2 R300.2 R309.2 U300.20(VCC) U301.20(VCC) U302.20(VCC) U303.20(VCC) U304.20(VCC) U305.20(VCC)
GND: C300.1 C301.1 C302.1 C303.1 C304.1 C305.1 C306.1 C307.1 C308.1 C309.1 C310.1 C311.1 J300.5 J300.6 J301.5 J301.6 P0.16 P1.16 P2.16 P3.16 R301.4 R301.8 R303.4 R303.8 R305.4 R305.8 R306.4 R306.8 R307.4 R307.8 R308.4 R308.8 R311.4 R311.8 R313.4 R313.8 U300.5(A4) U300.9(A8) U300.10(GND) U300.19(~{OE2}) U301.10(GND) U301.19(~{OE2}) U302.5(A4) U302.9(A8) U302.10(GND) U302.19(~{OE2}) U303.5(A4) U303.9(A8) U303.10(GND) U303.19(~{OE2}) U304.10(GND) U304.19(~{OE2}) U305.5(A4) U305.9(A8) U305.10(GND) U305.19(~{OE2})
A0: P0.9 P1.9 R302.5
A1: P2.9 P3.9 R310.5
B0: P0.10 P1.10 R302.6
B1: P2.10 P3.10 R310.6
C0: P0.11 P1.11 R302.7
C1: P2.11 P3.11 R310.7
CLK_0: P0.13 P1.13 R304.6
CLK_1: P2.13 P3.13 R312.6
D0: P0.12 P1.12 R302.8
D1: P2.12 P3.12 R310.8
E0: J300.1 J300.2 R304.5
E1: J301.1 J301.2 R312.5
EN_DISPLAY: U300.1(~{OE1}) U301.1(~{OE1}) U302.1(~{OE1}) U303.1(~{OE1}) U304.1(~{OE1}) U305.1(~{OE1}) ; port EN_DISPLAY
HUB75_0_B1: U300.4(A3) ; port HUB75_DAT_0.HUB75_0_B1
HUB75_0_B2: U300.8(A7) ; port HUB75_DAT_0.HUB75_0_B2
HUB75_0_G1: U300.3(A2) ; port HUB75_DAT_0.HUB75_0_G1
HUB75_0_G2: U300.7(A6) ; port HUB75_DAT_0.HUB75_0_G2
HUB75_0_R1: U300.2(A1) ; port HUB75_DAT_0.HUB75_0_R1
HUB75_0_R2: U300.6(A5) ; port HUB75_DAT_0.HUB75_0_R2
HUB75_1_B1: U302.4(A3) ; port HUB75_DAT_1.HUB75_1_B1
HUB75_1_B2: U302.8(A7) ; port HUB75_DAT_1.HUB75_1_B2
HUB75_1_G1: U302.3(A2) ; port HUB75_DAT_1.HUB75_1_G1
HUB75_1_G2: U302.7(A6) ; port HUB75_DAT_1.HUB75_1_G2
HUB75_1_R1: U302.2(A1) ; port HUB75_DAT_1.HUB75_1_R1
HUB75_1_R2: U302.6(A5) ; port HUB75_DAT_1.HUB75_1_R2
HUB75_2_B1: U303.4(A3) ; port HUB75_DAT_2.HUB75_2_B1
HUB75_2_B2: U303.8(A7) ; port HUB75_DAT_2.HUB75_2_B2
HUB75_2_G1: U303.3(A2) ; port HUB75_DAT_2.HUB75_2_G1
HUB75_2_G2: U303.7(A6) ; port HUB75_DAT_2.HUB75_2_G2
HUB75_2_R1: U303.2(A1) ; port HUB75_DAT_2.HUB75_2_R1
HUB75_2_R2: U303.6(A5) ; port HUB75_DAT_2.HUB75_2_R2
HUB75_3_B1: U305.4(A3) ; port HUB75_DAT_3.HUB75_3_B1
HUB75_3_B2: U305.8(A7) ; port HUB75_DAT_3.HUB75_3_B2
HUB75_3_G1: U305.3(A2) ; port HUB75_DAT_3.HUB75_3_G1
HUB75_3_G2: U305.7(A6) ; port HUB75_DAT_3.HUB75_3_G2
HUB75_3_R1: U305.2(A1) ; port HUB75_DAT_3.HUB75_3_R1
HUB75_3_R2: U305.6(A5) ; port HUB75_DAT_3.HUB75_3_R2
HUB75_A: U301.2(A1) U304.2(A1) ; port HUB75_CTRL.HUB75_A
HUB75_B: U301.3(A2) U304.3(A2) ; port HUB75_CTRL.HUB75_B
HUB75_C: U301.4(A3) U304.4(A3) ; port HUB75_CTRL.HUB75_C
HUB75_CLK: U301.7(A6) U304.7(A6) ; port HUB75_CTRL.HUB75_CLK
HUB75_D: U301.5(A4) U304.5(A4) ; port HUB75_CTRL.HUB75_D
HUB75_E: U301.6(A5) U304.6(A5) ; port HUB75_CTRL.HUB75_E
HUB75_LAT: U301.8(A7) U304.8(A7) ; port HUB75_CTRL.HUB75_LAT
HUB75_OE: U301.9(A8) U304.9(A8) ; port HUB75_CTRL.HUB75_OE
LAT_0: P0.14 P1.14 R304.7
LAT_1: P2.14 P3.14 R312.7
OE_0: P0.15 P1.15 R304.8
OE_1: P2.15 P3.15 R312.8
PIN4_E0: J300.3 P0.4 P1.4
PIN4_E1: J301.3 P2.4 P3.4
PIN8_E0: J300.4 P0.8 P1.8
PIN8_E1: J301.4 P2.8 P3.8
R0_B1: P0.3 R301.7
R0_B2: P0.7 R303.7
R0_G1: P0.2 R301.6
R0_G2: P0.6 R303.6
R0_R1: P0.1 R301.5
R0_R2: P0.5 R303.5
R1_B1: P1.3 R305.7
R1_B2: P1.7 R306.7
R1_G1: P1.2 R305.6
R1_G2: P1.6 R306.6
R1_R1: P1.1 R305.5
R1_R2: P1.5 R306.5
R2_B1: P2.3 R307.7
R2_B2: P2.7 R308.7
R2_G1: P2.2 R307.6
R2_G2: P2.6 R308.6
R2_R1: P2.1 R307.5
R2_R2: P2.5 R308.5
R3_B1: P3.3 R311.7
R3_B2: P3.7 R313.7
R3_G1: P3.2 R311.6
R3_G2: P3.6 R313.6
R3_R1: P3.1 R311.5
R3_R2: P3.5 R313.5
Y0_A: R302.1 U301.18(Y1)
Y0_B: R302.2 U301.17(Y2)
Y0_B1: R301.3 U300.16(Y3)
Y0_B2: R303.3 U300.12(Y7)
Y0_C: R302.3 U301.16(Y3)
Y0_CLK: R304.2 U301.13(Y6)
Y0_D: R302.4 U301.15(Y4)
Y0_E: R304.1 U301.14(Y5)
Y0_G1: R301.2 U300.17(Y2)
Y0_G2: R303.2 U300.13(Y6)
Y0_LAT: R304.3 U301.12(Y7)
Y0_OE: R300.1 R304.4 U301.11(Y8)
Y0_R1: R301.1 U300.18(Y1)
Y0_R2: R303.1 U300.14(Y5)
Y1_A: R310.1 U304.18(Y1)
Y1_B: R310.2 U304.17(Y2)
Y1_B1: R305.3 U302.16(Y3)
Y1_B2: R306.3 U302.12(Y7)
Y1_C: R310.3 U304.16(Y3)
Y1_CLK: R312.2 U304.13(Y6)
Y1_D: R310.4 U304.15(Y4)
Y1_E: R312.1 U304.14(Y5)
Y1_G1: R305.2 U302.17(Y2)
Y1_G2: R306.2 U302.13(Y6)
Y1_LAT: R312.3 U304.12(Y7)
Y1_OE: R309.1 R312.4 U304.11(Y8)
Y1_R1: R305.1 U302.18(Y1)
Y1_R2: R306.1 U302.14(Y5)
Y2_B1: R307.3 U303.16(Y3)
Y2_B2: R308.3 U303.12(Y7)
Y2_G1: R307.2 U303.17(Y2)
Y2_G2: R308.2 U303.13(Y6)
Y2_R1: R307.1 U303.18(Y1)
Y2_R2: R308.1 U303.14(Y5)
Y3_B1: R311.3 U305.16(Y3)
Y3_B2: R313.3 U305.12(Y7)
Y3_G1: R311.2 U305.17(Y2)
Y3_G2: R313.2 U305.13(Y6)
Y3_R1: R311.1 U305.18(Y1)
Y3_R2: R313.1 U305.14(Y5)

Not connected (* = marked no-connect by the designer): U300 11(Y8)* 15(Y4)*; U302 11(Y8)* 15(Y4)*; U303 11(Y8)* 15(Y4)*; U305 11(Y8)* 15(Y4)*

### Notes on the sheet
- (near P0) HUB75_0
- (near P1) HUB75_1
- (near J300) HUB75E Switch
- (near P2) HUB75_2
- (near P3) HUB75_3

### Library data of the parts
C300 C302 C304 C306 C308 C310 = CAP_0603_16V: as C5 on sheet PowerSupply; Designator: ?; Value: 1uF; Dielectric: ?; Manufacturer Reference: ?; Power: ?; Excepted: ?
C301 C303 C305 C307 C309 C311 = CAP_0603_16V: SMD Capacitor; Designator: ?; Value: 100nF; Dielectric: ?; Manufacturer Reference: ?; Tolerance: ?; Power: ?; Excepted: ?
J300 J301 = ZX-PZ2.54-2-3PZZ: Manufacturer: Megastar(兆星); Add into BOM: yes; Pin Structure: 2x3P; Pitch: 2.54mm; Circluar Pins/Square Pins: Pin Header; Current Rating: 3A; Voltage Rating (Max): 1kV; Symbol: ZX-PZ2.54-2-3PZZ; Device: ZX-PZ2.54-2-3PZZ; LCSC Part Name: 2x3P 间距:2.54mm 方针 直插; Supplier Part: C7501274; Manufacturer Part: ZX-PZ2.54-2-3PZZ; Supplier Footprint: 插件,P=2.54mm; JLCPCB Part Class: Extended Part; Datasheet: https://item.szlcsc.com/datasheet/ZX-PZ2.54-2-3PZZ/8582487.html; Supplier: LCSC; Convert to PCB: yes; Row Spacing: 2.54mm; Mounting Type: Through Hole; Number of Rows: 2; Number of Pins: 6P; Length of Mating Pin: 6mm; Insulation Height: 2.5mm; Length of End Connection Pin: 3mm; Contact Material: Brass; Contact Plating: Gold; Operating Temperature: -40℃~+105℃; Color: Black; Designator: ?; Dielectric: ?; Excepted: ?; Package: ?; Power: ?; Tolerance: ?; Value: ?; Voltage: ?
P0-P3 = 302-S161: 2.54mm Dual Row, Vertical Box Header; Manufacturer_Name: On Shore Technology Inc.; Geometry.Height: 9.05mm; Manufacturer_Part_Number: 302-S161; Mouser Part Number: *; Mouser Price/Stock: *; Arrow Part Number: 302-S161; Arrow Price/Stock: null?region=nac; Datasheet Link: http://www.on-shore.com/wp-content/uploads/2018/04/302-SXX1.pdf
R300 R309 = Resistor: SMD Resistor; Designator: ?; Value: 10K; Voltage: ?; Dielectric: ?; Manufacturer Reference: ?; Excepted: ?
R301-R308 R310-R313 = YC124-FR-0733RL: 33 Ohm +/-1% 62.5mW Power Per Element Isolated 4 Resistor Network/Array +/-200ppm/C 0804, Convex, Long Side Terminals; Manufacturer_Name: Yageo Group; Geometry.Height: 0.55mm; Manufacturer_Part_Number: YC124-FR-0733RL; Mouser Part Number: 603-YC124-FR-0733RL; Mouser Price/Stock: https://www.mouser.co.uk/ProductDetail/YAGEO/YC124-FR-0733RL?qs=Omyi%252BwOkBJUSdM%252BPj18Bfg%3D%3D; Arrow Part Number: YC124-FR-0733RL; Arrow Price/Stock: https://www.arrow.com/en/products/yc124-fr-0733rl/yageo.html?utm_currency=USD&region=nac; Datasheet Link: https://yageogroup.com/content/datasheet/asset/file/PYU-YC_TC_GROUP_51_ROHS_L
U300-U305 = SN74AHCT541PWR: Octal Buffers/Drivers With 3-State Outputs; Manufacturer_Name: Texas Instruments; Geometry.Height: 1.2mm; Manufacturer_Part_Number: SN74AHCT541PWR; Mouser Part Number: 595-SN74AHCT541PWR; Mouser Price/Stock: https://www.mouser.co.uk/ProductDetail/Texas-Instruments/SN74AHCT541PWR?qs=L4Mc90zKIphKuQtt%252Bo5snQ%3D%3D; Arrow Part Number: SN74AHCT541PWR; Arrow Price/Stock: https://www.arrow.com/en/products/sn74ahct541pwr/texas-instruments.html?utm_currency=USD&region=nac; Datasheet Link: http://www.ti.com/lit/gpn/sn74ahct541

## Sheet Wifi_Coprocessor.SchDoc
size A3; SheetNumber: 4; SheetTotal: 5
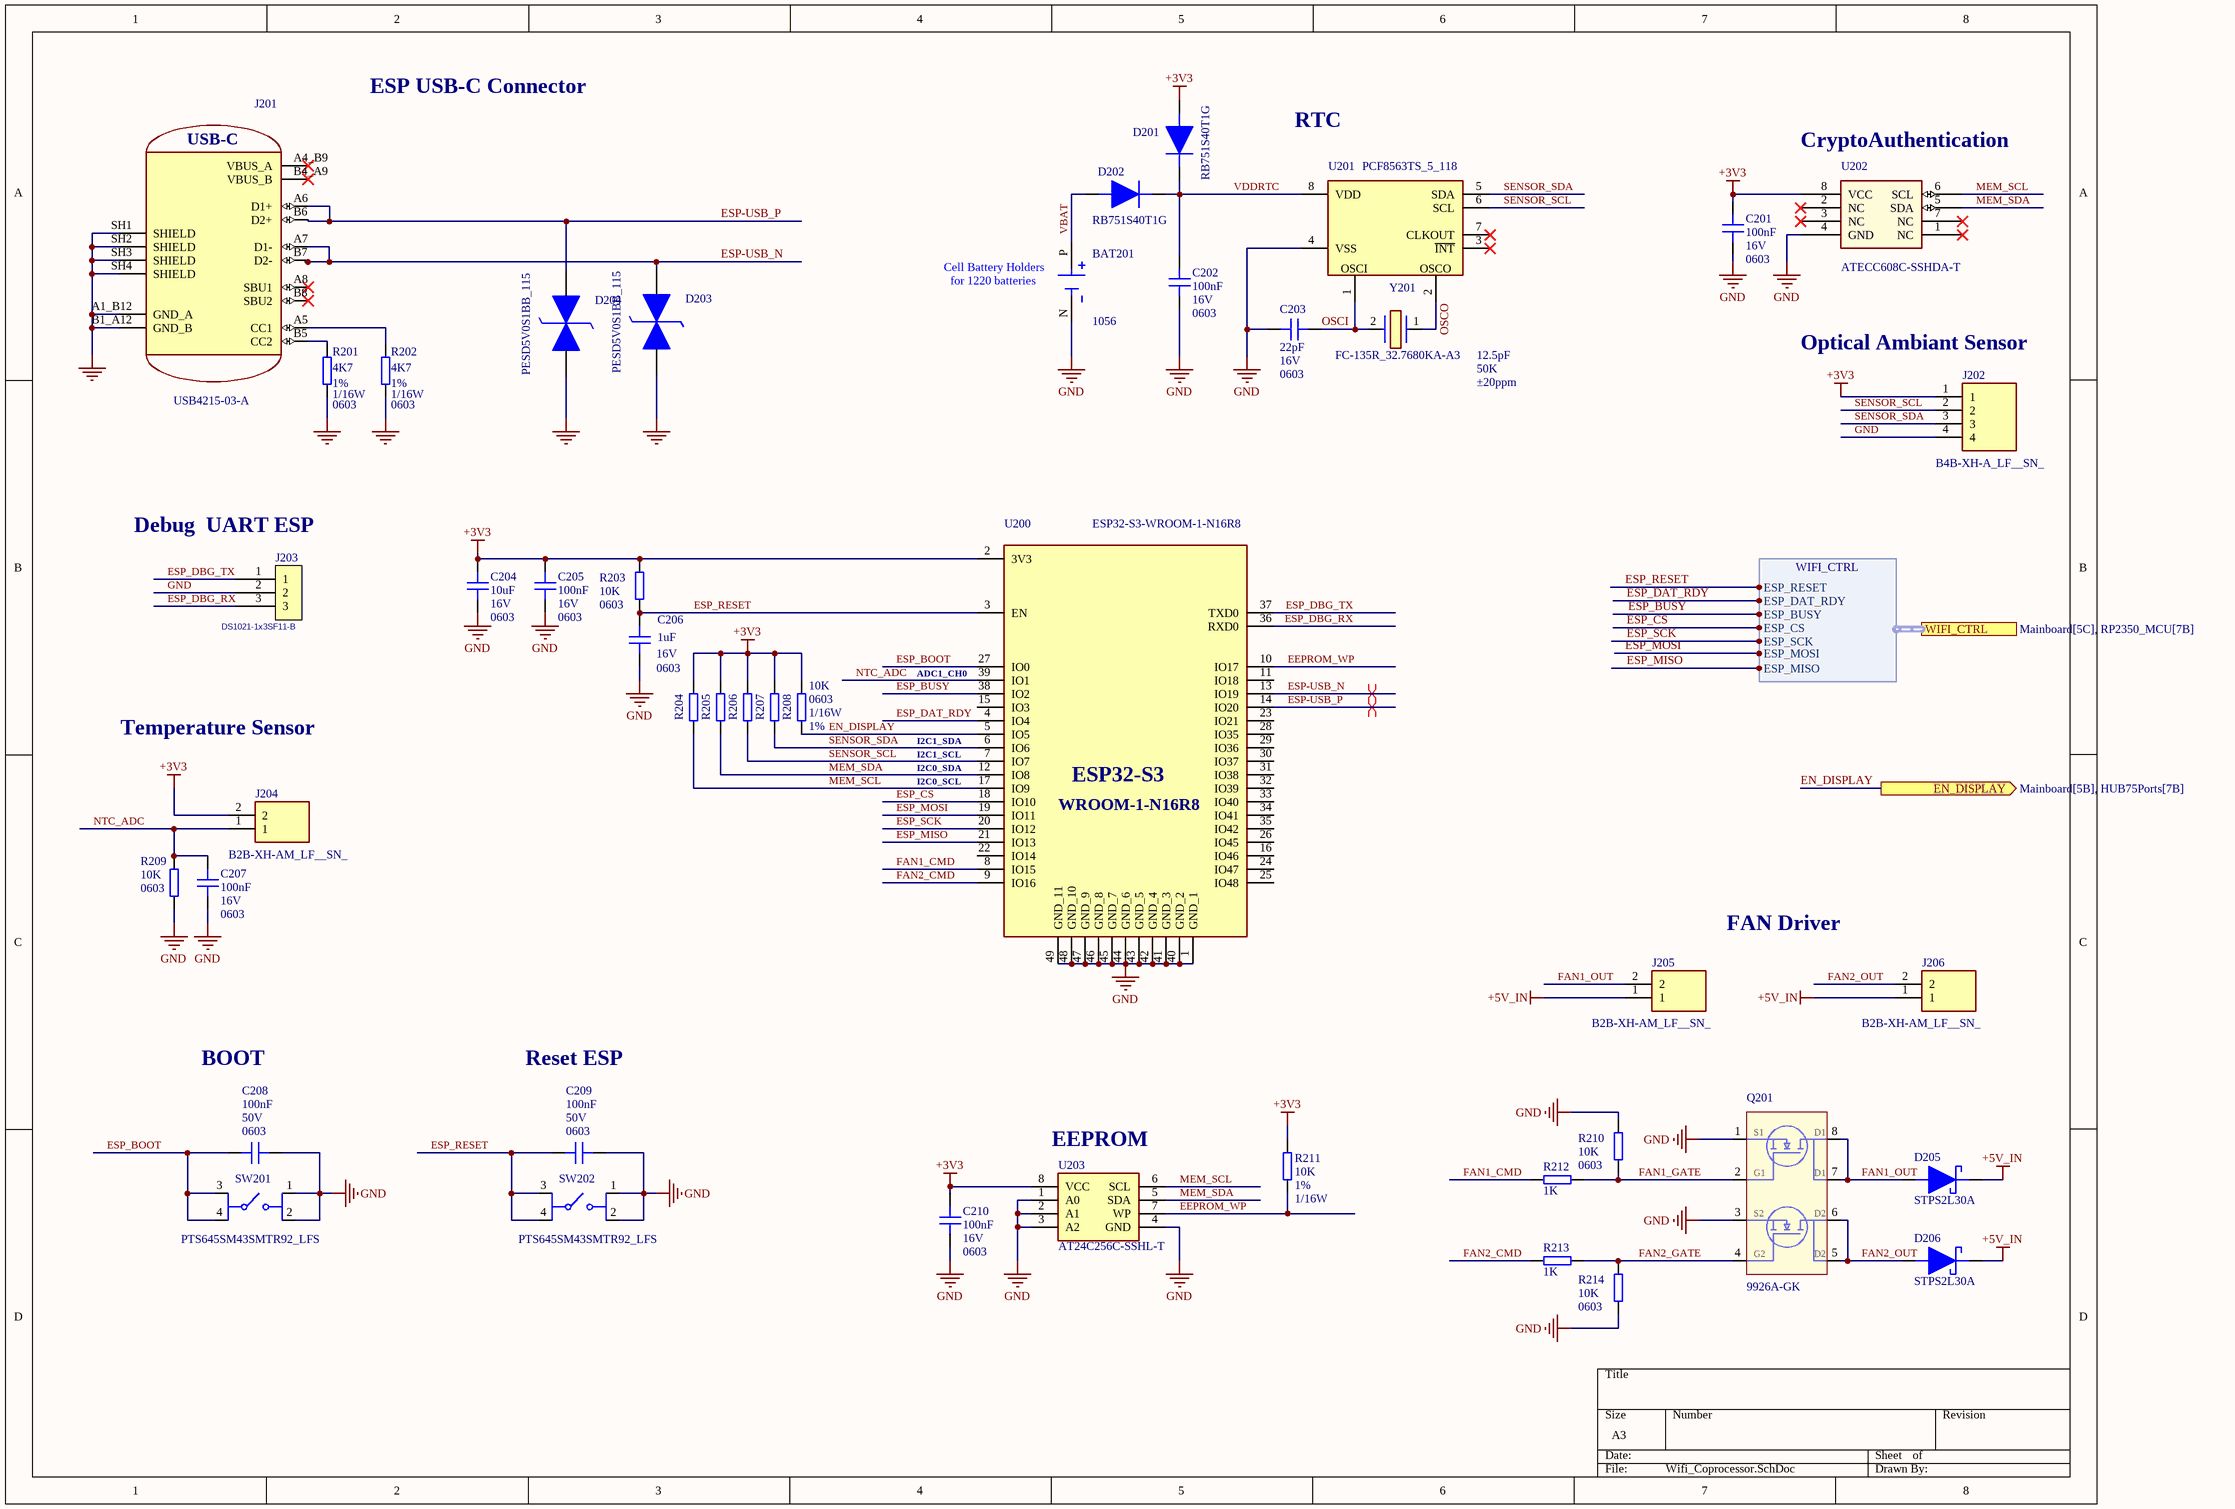
[diagram p4: Wifi_Coprocessor.SchDoc]

### Parts
BAT201  1056  [1056]
C201  100nF  Voltage: 16V  Package: 0603  [C0603]
C202  100nF  Voltage: 16V  Package: 0603  [C0603]
C203  22pF  Voltage: 16V  Package: 0603  [C0603]
C204  10uF  Voltage: 16V  Package: 0603  [C0603]
C205  100nF  Voltage: 16V  Package: 0603  [C0603]
C206  1uF  Voltage: 16V  Package: 0603  [C0603]
C207  100nF  Voltage: 16V  Package: 0603  [C0603]
C208  100nF  Voltage: 50V  Package: 0603  [C0603]
C209  100nF  Voltage: 50V  Package: 0603  [C0603]
C210  100nF  Voltage: 16V  Package: 0603  [C0603]
D201  RB751S40T1G  [SODFL1608X70N]
D202  RB751S40T1G  [SODFL1608X70N]
D203  PESD5V0S1BB_115  [SODFL1608X65N]
D204  PESD5V0S1BB_115  [SODFL1608X65N]
D205  STPS2L30A  [SMA_STM]
D206  STPS2L30A  [SMA_STM]
J201  USB4215-03-A  [GCT_USB4215-03-A_REVA]
J202  B4B-XH-A_LF__SN_  [B4BXHALFSN]
J203  DS1021-1x3SF11-B  [HDR-TH_3P-P2.54-V-M]
J204  B2B-XH-AM_LF__SN_  [B2BXHAMLFSN]
J205  B2B-XH-AM_LF__SN_  [B2BXHAMLFSN]
J206  B2B-XH-AM_LF__SN_  [B2BXHAMLFSN]
Q201  9926A-GK  [SOIC127P600X175-8N]
R201  4K7  Package: 0603  Tolerence: 1%  Power: 1/16W  [R0603_1608]
R202  4K7  Package: 0603  Tolerence: 1%  Power: 1/16W  [R0603_1608]
R203  10K  Package: 0603  [R0603_1608]
R204  10K  [R0603_1608]  (value not drawn)
R205  10K  [R0603_1608]  (value not drawn)
R206  10K  [R0603_1608]  (value not drawn)
R207  10K  [R0603_1608]  (value not drawn)
R208  Package: 0603  Tolerence: 1%  Power: 1/16W  [R0603_1608]  (hidden comment: 10K)
R209  10K  Package: 0603  [R0603_1608]
R210  10K  Package: 0603  [R0603_1608]
R211  Tolerence: 1%  Power: 1/16W  [R0603_1608]  (hidden comment: 10K)
R212  1K  [R0603_1608]
R213  1K  [R0603_1608]
R214  10K  Package: 0603  [R0603_1608]
SW201  PTS645SM43SMTR92_LFS  [PTS645SM43SMTR92LFS]
SW202  PTS645SM43SMTR92_LFS  [PTS645SM43SMTR92LFS]
U200  ESP32-S3-WROOM-1-N16R8  [ESP32S3WROOM1N16R8]
U201  PCF8563TS_5_118  [SOT65P490X110-8N]
U202  ATECC608C-SSHDA-T  [SOIC8_SWB_MCH]
U203  AT24C256C-SSHL-T  [24LC32A]
Y201  FC-135R_32.7680KA-A3  Load Capacitance: 12.5pF  ESR: 50K  Parameter 1: ±20ppm  [FC135R327680KAA3]

### Ports
EN_DISPLAY (out, see Mainboard[5B], HUB75Ports[7B]), WIFI_CTRL (harness WIFI_CTRL, see Mainboard[5C], RP2350_MCU[7B])

### Harnesses
WIFI_CTRL: ESP_RESET, ESP_DAT_RDY, ESP_BUSY, ESP_CS, ESP_SCK, ESP_MOSI, ESP_MISO

### Nets
+3V3: C201.2 C204.2 C205.2 C210.2 D201.2(A) J202.1 J204.2 R203.1 R204.1 R205.1 R206.1 R207.1 R208.1 R211.1 U200.2(3V3) U202.8(VCC) U203.8(VCC)
+5V_IN: D205.1(K) D206.1(K) J205.1 J206.1
GND: BAT201.N(NEG) C201.1 C202.1 C203.2 C204.1 C205.1 C206.1 C207.1 C208.1 C209.1 C210.1 D203.1(K1) D204.1(K1) J201.A1_B12(GND_A) J201.B1_A12(GND_B) J201.SH1(SHIELD) J201.SH2(SHIELD) J201.SH3(SHIELD) J201.SH4(SHIELD) J202.4 J203.2 Q201.1(S1) Q201.3(S2) R201.1 R202.1 R209.2 R210.1 R214.2 SW201.1(NO_1) SW201.2(NO_2) SW202.1(NO_1) SW202.2(NO_2) U200.1(GND_1) U200.40(GND_2) U200.41(GND_3) U200.42(GND_4) U200.43(GND_5) U200.44(GND_6) U200.45(GND_7) U200.46(GND_8) U200.47(GND_9) U200.48(GND_10) U200.49(GND_11) U201.4(VSS) U202.4(GND) U203.1(A0) U203.2(A1) U203.3(A2) U203.4(GND)
EEPROM_WP: R211.2 U200.10(IO17) U203.7(WP)
EN_DISPLAY: R208.2 U200.5(IO5) ; port EN_DISPLAY
ESP-USB_N: D203.2(K2) J201.A7(D1-) J201.B7(D2-) U200.13(IO19)
ESP-USB_P: D204.2(K2) J201.A6(D1+) J201.B6(D2+) U200.14(IO20)
ESP_BOOT: C208.2 SW201.3(COM_1) SW201.4(COM_2) U200.27(IO0)
ESP_BUSY: U200.38(IO2) ; port WIFI_CTRL.ESP_BUSY
ESP_CS: U200.18(IO10) ; port WIFI_CTRL.ESP_CS
ESP_DAT_RDY: U200.4(IO4) ; port WIFI_CTRL.ESP_DAT_RDY
ESP_DBG_RX: J203.3 U200.36(RXD0)
ESP_DBG_TX: J203.1 U200.37(TXD0)
ESP_MISO: U200.21(IO13) ; port WIFI_CTRL.ESP_MISO
ESP_MOSI: U200.19(IO11) ; port WIFI_CTRL.ESP_MOSI
ESP_RESET: C206.2 C209.2 R203.2 SW202.3(COM_1) SW202.4(COM_2) U200.3(EN) ; port WIFI_CTRL.ESP_RESET
ESP_SCK: U200.20(IO12) ; port WIFI_CTRL.ESP_SCK
FAN1_CMD: R212.1 U200.8(IO15)
FAN1_GATE: Q201.2(G1) R210.2 R212.2
FAN1_OUT: D205.2(A) J205.2 Q201.7(D1) Q201.8(D1)
FAN2_CMD: R213.1 U200.9(IO16)
FAN2_GATE: Q201.4(G2) R213.2 R214.1
FAN2_OUT: D206.2(A) J206.2 Q201.5(D2) Q201.6(D2)
MEM_SCL: R204.2 U200.17(IO9) U202.6(SCL) U203.6(SCL)
MEM_SDA: R205.2 U200.12(IO8) U202.5(SDA) U203.5(SDA)
NTC_ADC: C207.2 J204.1 R209.1 U200.39(IO1)
OSCI: C203.1 U201.1(OSCI) Y201.2(CRYSTAL_2)
OSCO: U201.2(OSCO) Y201.1
SENSOR_SCL: J202.2 R206.2 U200.7(IO7) U201.6(SCL)
SENSOR_SDA: J202.3 R207.2 U200.6(IO6) U201.5(SDA)
VBAT: BAT201.P(POS) D202.2(A)
VDDRTC: C202.2 D201.1(K) D202.1(K) U201.8(VDD)
NetJ201_A5: J201.A5(CC1) R202.2
NetJ201_B5: J201.B5(CC2) R201.2

Not connected (* = marked no-connect by the designer): J201 A4_B9(VBUS_A)* A8(SBU1)* B4_A9(VBUS_B)* B8(SBU2)*; U200 11(IO18) 15(IO3) 16(IO46) 22(IO14) 23(IO21) 24(IO47) 25(IO48) 26(IO45) 28(IO35) 29(IO36) 30(IO37) 31(IO38) 32(IO39) 33(IO40) 34(IO41) 35(IO42); U201 3(~{INT})* 7(CLKOUT)*; U202 1(NC)* 2(NC)* 3(NC)* 7(NC)*

### Layout directives
differential pair; differential pair class DIFF_USB: ESP-USB_N, ESP-USB_P

### Notes on the sheet
- ESP USB-C Connector
- RTC
- (near U202) CryptoAuthentication
- (near BAT201) Cell Battery Holders
- (near BAT201) for 1220 batteries
- (near J202) Optical Ambiant Sensor
- (near J203) Debug  UART ESP
- (near U200) ADC1_CH0
- Temperature Sensor
- (near U200) I2C1_SDA
- (near U200) I2C1_SCL
- (near U200) I2C0_SDA
- (near U200) I2C0_SCL
- FAN Driver
- BOOT
- Reset ESP
- (near U203) EEPROM
- (in symbol ESP32-S3-WROOM-1-N16R8) ESP32-S3; WROOM-1-N16R8
- (in symbol USB4215-03-A) USB-C

### Library data of the parts
BAT201 = 1056: Coin Cell Battery Holders S/M Coin cell hldr for 1220 batteries; Manufacturer_Name: Keystone Electronics; Geometry.Height: 4.24mm; Manufacturer_Part_Number: 1056; Mouser Part Number: 534-1056; Mouser Price/Stock: https://www.mouser.co.uk/ProductDetail/Keystone-Electronics/1056?qs=sZfk%252BfAlGe4w00bCJntjFg%3D%3D; Arrow Part Number: *; Arrow Price/Stock: *; Datasheet Link: https://www.keyelco.com/product.cfm/product_id/715
C201-C203 C205 C207-C210 = CAP_0603_16V: SMD Capacitor; Designator: ?; Dielectric: ?; Manufacturer Reference: ?; Tolerance: ?; Power: ?; Excepted: ?
  C201 C202 C205 C207-C210: Value: 100nF
  C203: Value: 22pF
C204 C206 = CAP_0603_16V: as C5 on sheet PowerSupply; Designator: ?; Dielectric: ?; Manufacturer Reference: ?; Power: ?; Excepted: ?
  C204: Value: 10uF
  C206: Value: 1uF
D201 D202 = RB751S40T1G: Extremely Fast Switching Speed; Extremely Low Forward Voltage: 0.28 V (Typ) @ IF = 1.0 mAdc; Low Reverse Current; LeadFree Plating; These Devices are PbFree, Halogen Free/BFR Free and are RoHS Compliant; Manufacturer_Name: onsemi; Geometry.Height: 0.7mm; Manufacturer_Part_Number: RB751S40T1G; Mouser Part Number: 863-RB751S40T1G; Mouser Price/Stock: https://www.mouser.co.uk/ProductDetail/onsemi/RB751S40T1G?qs=xZq1yRCsb1eQ%2Ff4mzLQKzQ%3D%3D; Arrow Part Number: RB751S40T1G; Arrow Price/Stock: https://www.arrow.com/en/products/rb751s40t1g/on-semiconductor.html?utm_currency=USD&region=asia; Datasheet Link: https://www.onsemi.com/pub/Collateral/RB751S40T1-D.PDF
D203 D204 = PESD5V0S1BB_115: as D2 on sheet PowerSupply; Mouser Part Number: 771-PESD5V0S1BB-T/R; Mouser Price/Stock: https://www.mouser.co.uk/ProductDetail/Nexperia/PESD5V0S1BB115?qs=LOCUfHb8d9vW06zz0pOppQ%3D%3D; Arrow Part Number: PESD5V0S1BB,115; Arrow Price/Stock: https://www.arrow.com/en/products/pesd5v0s1bb115/nexperia?region=nac; Datasheet Link: https://assets.nexperia.com/documents/data-sheet/PESD5V0S1BB.pdf
D205 D206 = STPS2L30A: as D1 on sheet PowerSupply; Copyright: Copyright (C) 2025 Ultra Librarian. All rights reserved.; Manufacturer_Part_Number: STPS2L30A
J201 = USB4215-03-A: as J101 on sheet RP2350_MCU; SnapEDA_Link: https://www.snapeda.com/parts/USB4215-03-A/Global+Connector+Technology/view-part/?ref=snap; Package: None; Value: *; MP: USB4215-03-A; Check_prices: https://www.snapeda.com/parts/USB4215-03-A/Global+Connector+Technology/view-part/?ref=eda
J202 = B4B-XH-A_LF__SN_: CONN HEADER VERT 4POS 2.5MM; Manufacturer_Name: JST (JAPAN SOLDERLESS TERMINALS); Manufacturer_Part_Number: B4B-XH-A(LF)(SN); Geometry.Height: 7mm; Mouser Part Number: 306-B4BXHALFSN; Mouser Price/Stock: https://www.mouser.co.uk/ProductDetail/JST-Commercial/B4B-XH-ALFSN?qs=cdbOS8ANM9CfC08d%252BywhFw%3D%3D; Arrow Part Number: B4B-XH-A(LF)(SN); Arrow Price/Stock: https://www.arrow.com/en/products/b4b-xh-a-lf-sn/jst-manufacturing.html?utm_currency=USD&region=europe; Datasheet Link: https://datasheet.lcsc.com/szlcsc/JST-Sales-America-B4B-XH-A-LF-SN_C144395.pdf
J203 = DS1021-1x3SF11-B: as J103 on sheet RP2350_MCU; Symbol: DS1021-1X3SF11-B; Device: DS1021-1x3SF11-B; LCSC Part Name: 1x3P 间距:2.54mm 方针 直插; Supplier Part: C7430359; Manufacturer Part: DS1021-1x3SF11-B; Supplier Footprint: 插件,P=2.54mm; JLCPCB Part Class: Extended Part; Datasheet: https://item.szlcsc.com/datasheet/DS1021-1x3SF11-B/8430012.html; Supplier: LCSC; Convert to PCB: yes; Mounting Type: Through Hole; Number of Rows: 1; Number of Pins: 3P; Contact Material: Copper Alloy; Contact Plating: Gold; Operating Temperature: -40℃~+105℃; Color: Black; Designator: ?; Dielectric: ?; Excepted: ?; Package: ?; Power: ?; Tolerance: ?; Value: ?; Voltage: ?
J204-J206 = B2B-XH-AM_LF__SN_: CONN HEADER VERT 2POS 2.5MM; Manufacturer_Name: JST (JAPAN SOLDERLESS TERMINALS); Manufacturer_Part_Number: B2B-XH-AM(LF)(SN); Geometry.Height: 7mm; Mouser Part Number: 306-B2B-XH-AMLFSNP; Mouser Price/Stock: https://www.mouser.co.uk/ProductDetail/JST-Commercial/B2B-XH-AMLFSN?qs=cdbOS8ANM9BJgHgwB7WxQw%3D%3D; Arrow Part Number: B2B-XH-AM(LF)(SN); Arrow Price/Stock: https://www.arrow.com/en/products/b2b-xh-am-lf-sn/jst-manufacturing.html?utm_currency=USD&region=europe; Datasheet Link: https://www.jst-mfg.com/product/pdf/eng/eXH.pdf
Q201 = 9926A-GK: Mosfet Canal N, RDS(ON) = 30 m @ VGS = 4.5 V; Low gate charge; RDS(ON) = 43 m @ VGS = 2.5 V; Optimized for use in battery protection circuits; +/-10 VGSS allows for wide operating voltage range; 6.5 A, 20 V; Manufacturer_Name: onsemi; Manufacturer_Part_Number: FDS9926A; Geometry.Height: 1.75mm; Mouser Part Number: 512-FDS9926A; Mouser Price/Stock: https://www.mouser.co.uk/ProductDetail/onsemi-Fairchild/FDS9926A?qs=HK%252BeIG1iaagpgrEVRWCDdA%3D%3D; Arrow Part Number: FDS9926A; Arrow Price/Stock: https://www.arrow.com/en/products/fds9926a/on-semiconductor?utm_currency=USD&region=nac; Datasheet Link: https://www.onsemi.com/pub/Collateral/FDS9926A-D.PDF
R201 R202 R208 R211 = Resistor: SMD Resistor; Designator: ?; Voltage: ?; Dielectric: ?; Manufacturer Reference: ?; Excepted: ?
  R201 R202: Value: 4K7
  R208: Value: 10K
  R211: Value: 10K; Package: 0603
R203-R207 R209 R210 R212-R214 = Resistor: as R3 on sheet PowerSupply; Designator: ?; Voltage: ?; Dielectric: ?; Manufacturer Reference: ?; Excepted: ?
  R203 R209 R210 R214: Value: 10K
  R204-R207: Value: 10K; Package: 0603
  R212 R213: Value: 1K; Package: 0603
SW201 SW202 = PTS645SM43SMTR92_LFS: as SW101 on sheet RP2350_MCU; Datasheet Link: https://www.ckswitches.com/media/1471/pts645.pdf; Height: 4.4mm; Mouser Part Number: 611-PTS645SM43SMTR92; Mouser Price/Stock: https://www.mouser.co.uk/ProductDetail/CK/PTS645SM43SMTR92-LFS?qs=Imq1NPwxi75hrUk5xRQGSg%3D%3D; Arrow Part Number: PTS645SM43SMTR92 LFS; Arrow Price/Stock: https://www.arrow.com/en/products/pts645sm43smtr92lfs/ck?utm_currency=USD&region=nac
U200 = ESP32-S3-WROOM-1-N16R8: Esspressif Multiprotocol Modules SMD Module, ESP32-S3R8, 3.3V, 8 MB Octal PSRAM Die, 16 MB Quad SPI Flash, PCB Antenna; Manufacturer_Name: Espressif Systems; Geometry.Height: 3.25mm; Manufacturer_Part_Number: ESP32-S3-WROOM-1-N16R8; Mouser Part Number: 356-ESP32S3WRM1N16R8; Mouser Price/Stock: https://www.mouser.co.uk/ProductDetail/Espressif-Systems/ESP32-S3-WROOM-1-N16R8?qs=Li%252BoUPsLEnvQc9gW6AMhZg%3D%3D; Arrow Part Number: *; Arrow Price/Stock: *; Datasheet Link: https://www.espressif.com/sites/default/files/documentation/esp32-s3-wroom-1_wroom-1u_datasheet_en.pdf
U201 = PCF8563TS_5_118: NXP - PCF8563TS/5,118 - REAL TIME CLOCK(RTC), 5.5V, I2C, TSSOP-8; Geometry.Height: 1.1mm; Manufacturer_Name: NXP; Manufacturer_Part_Number: PCF8563TS/5,118; Mouser Part Number: 771-PCF8563TS/5118; Mouser Price/Stock: https://www.mouser.co.uk/ProductDetail/NXP-Semiconductors/PCF8563TS-5118?qs=beN0Cyoe8Ynnzly4fQaDyw%3D%3D; Arrow Part Number: PCF8563TS/5,118; Arrow Price/Stock: https://www.arrow.com/en/products/pcf8563ts5118/nxp-semiconductors.html?utm_currency=USD&region=nac; Datasheet Link: http://www.nxp.com/docs/en/data-sheet/PCF8563.pdf
U202 = ATECC608C-SSHDA-T: Security ICs / Authentication ICs ECC/ECDH, I2C, SOIC T/R; Manufacturer_Name: Microchip; Copyright: Copyright (C) 2025 Ultra Librarian. All rights reserved.; Manufacturer_Part_Number: ATECC608C-SSHDA-T; RefDes: RefDes; Type: Type
U203 = AT24C256C-SSHL-T: EEPROM 256K (32K X 8), 2-WI 1.8V, SOIC; Manufacturer_Name: Microchip; Geometry.Height: 1.75mm; Manufacturer_Part_Number: AT24C256C-SSHL-T; Mouser Part Number: 556-AT24C256C-SSHL-T; Mouser Price/Stock: https://www.mouser.co.uk/ProductDetail/Microchip-Technology/AT24C256C-SSHL-T?qs=fzsaQExJLyR3ptk4tHE3tA%3D%3D; Arrow Part Number: AT24C256C-SSHL-T; Arrow Price/Stock: https://www.arrow.com/en/products/at24c256c-sshl-t/microchip-technology?utm_currency=USD&region=nac; Datasheet Link: http://www.atmel.com/Images/Atmel-8568-SEEPROM-AT24C256C-Datasheet.pdf
Y201 = FC-135R_32.7680KA-A3: Crystal or Oscillator, 32.768 kHz ±20ppm Crystal 12.5pF 50 kOhms 2-SMD, No Lead; Manufacturer_Name: Epson Timing; Manufacturer_Part_Number: FC-135R 32.7680KA-A3; Datasheet Link: https://eu.mouser.com/datasheet/2/137/FC_255_en-1649561.pdf; Height: 0.9mm; Mouser Part Number: 732-5R32.7680KA-A3; Mouser Price/Stock: https://www.mouser.co.uk/ProductDetail/Epson-Timing/FC-135R-32.7680KA-A3?qs=f9yNj16SXrIR19rZDPQCyw%3D%3D; Arrow Part Number: FC-135R 32.7680KA-A3; Arrow Price/Stock: https://www.arrow.com/en/products/fc-135r32.7680ka-a3/epson-electronics-america?region=nac